# EasyEDA Pro project N01-H6.epro, board PCB1_1
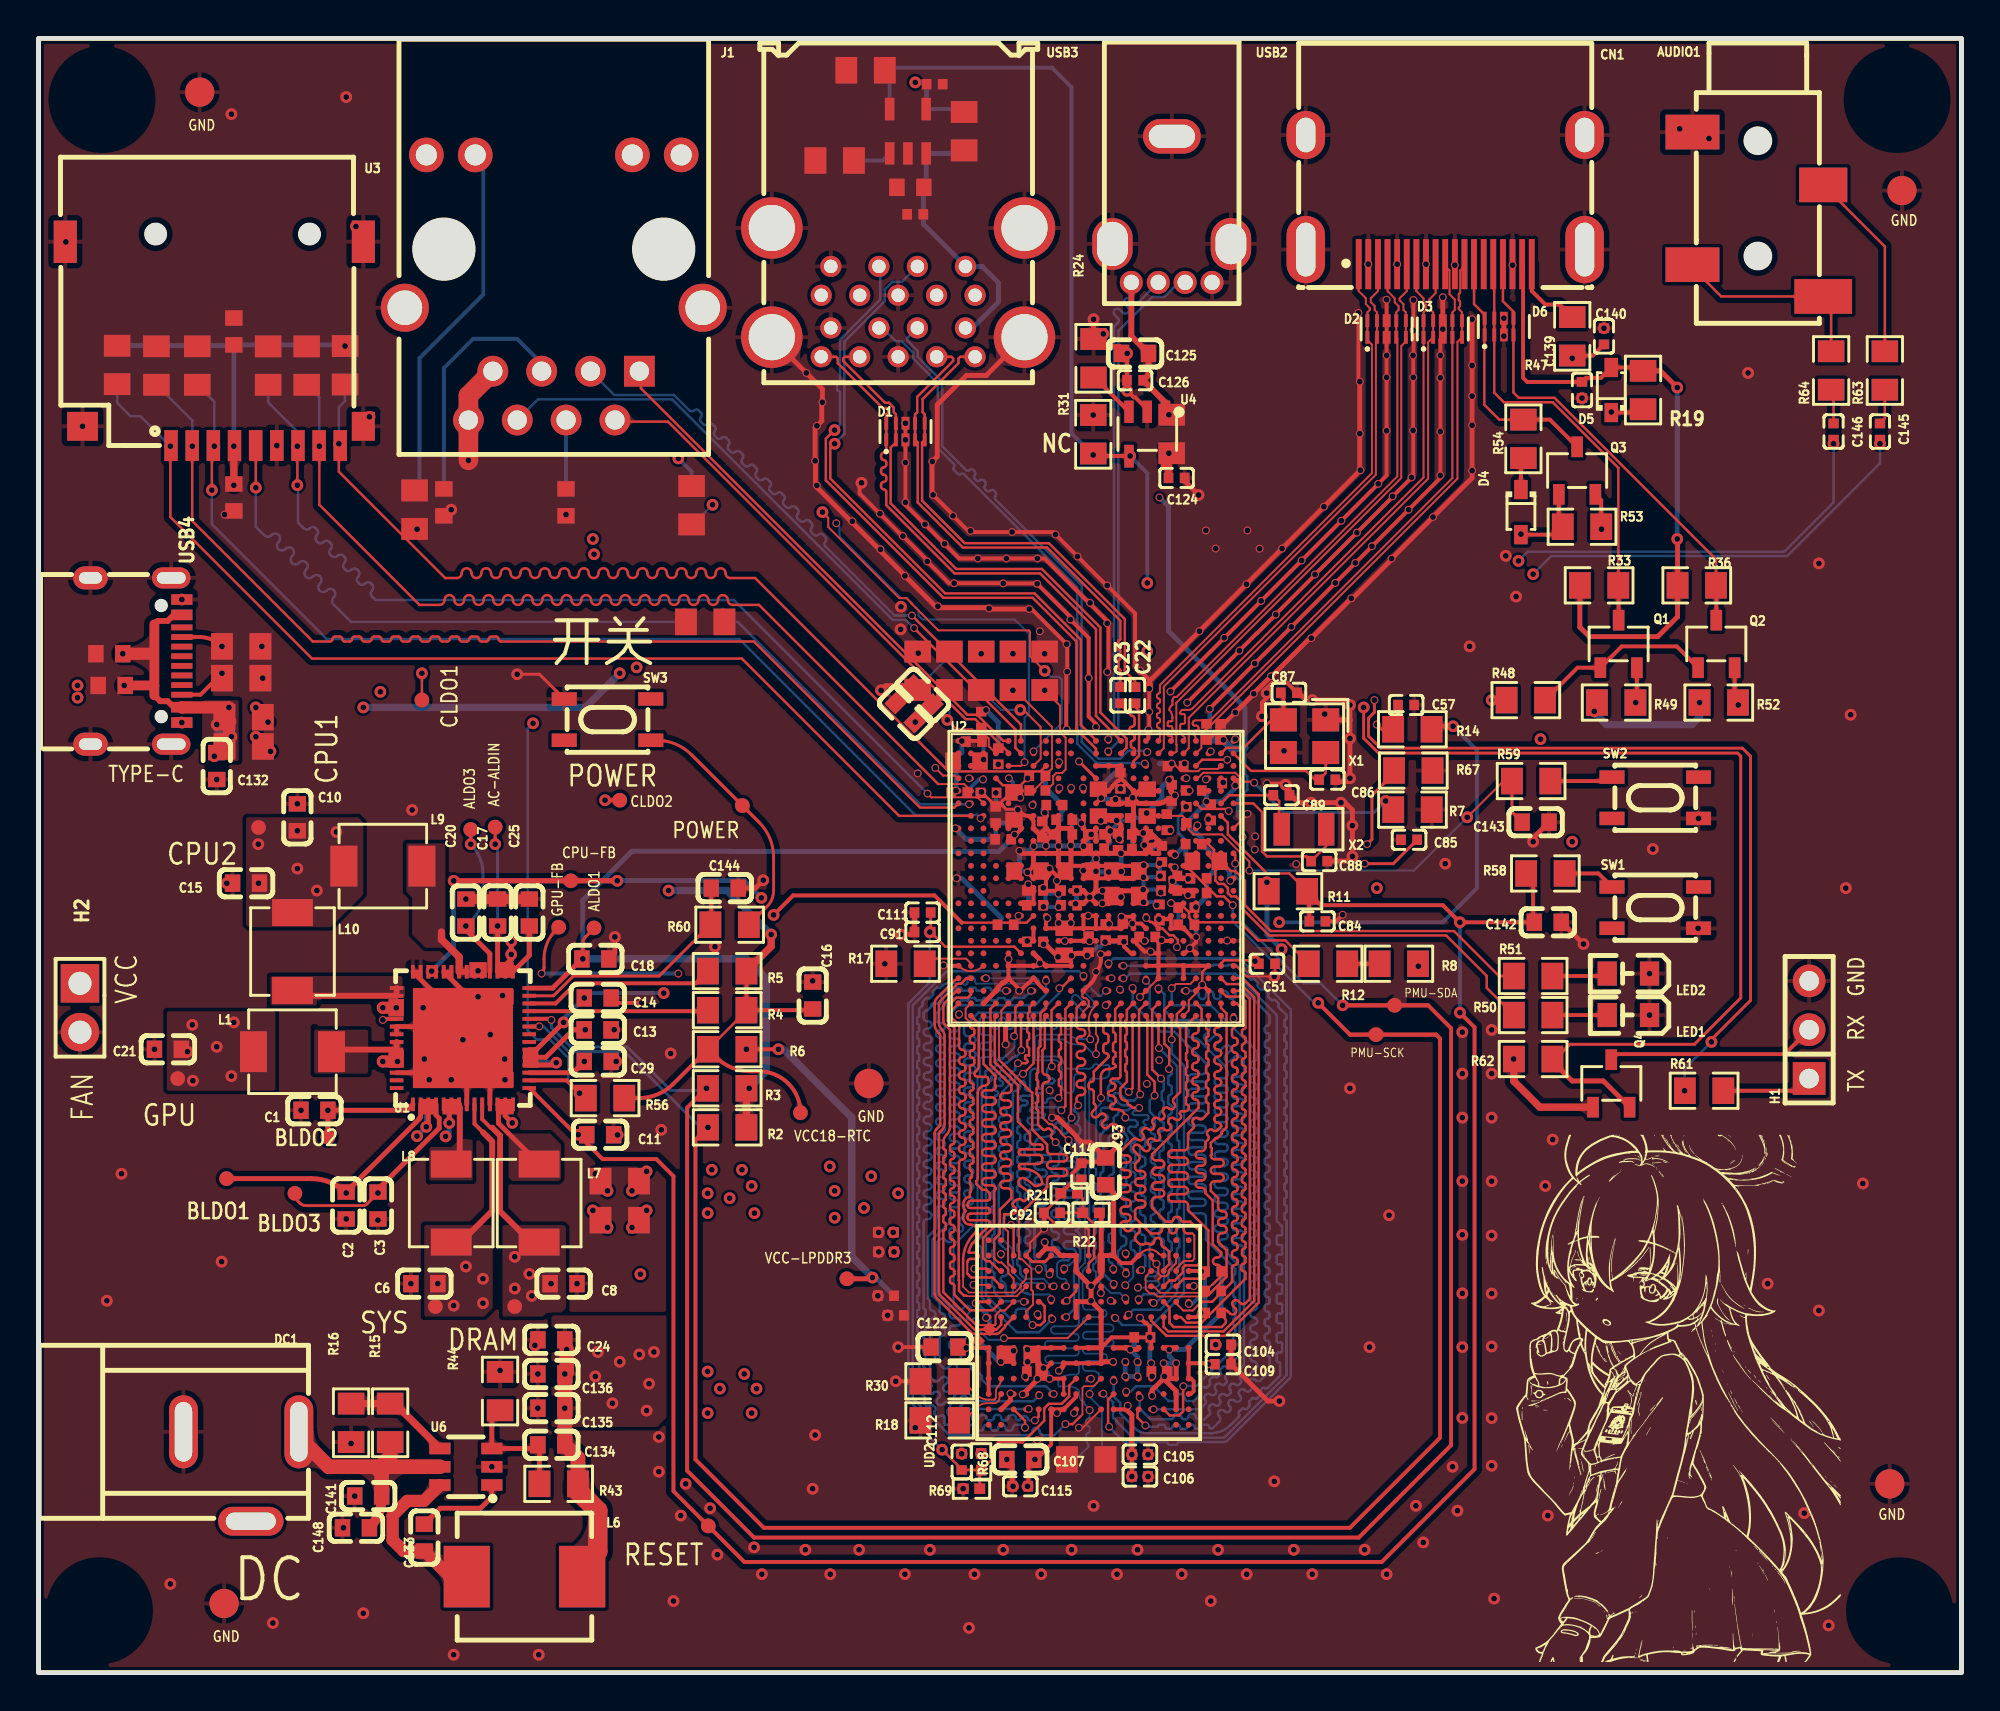
[diagram p7: board, top side]
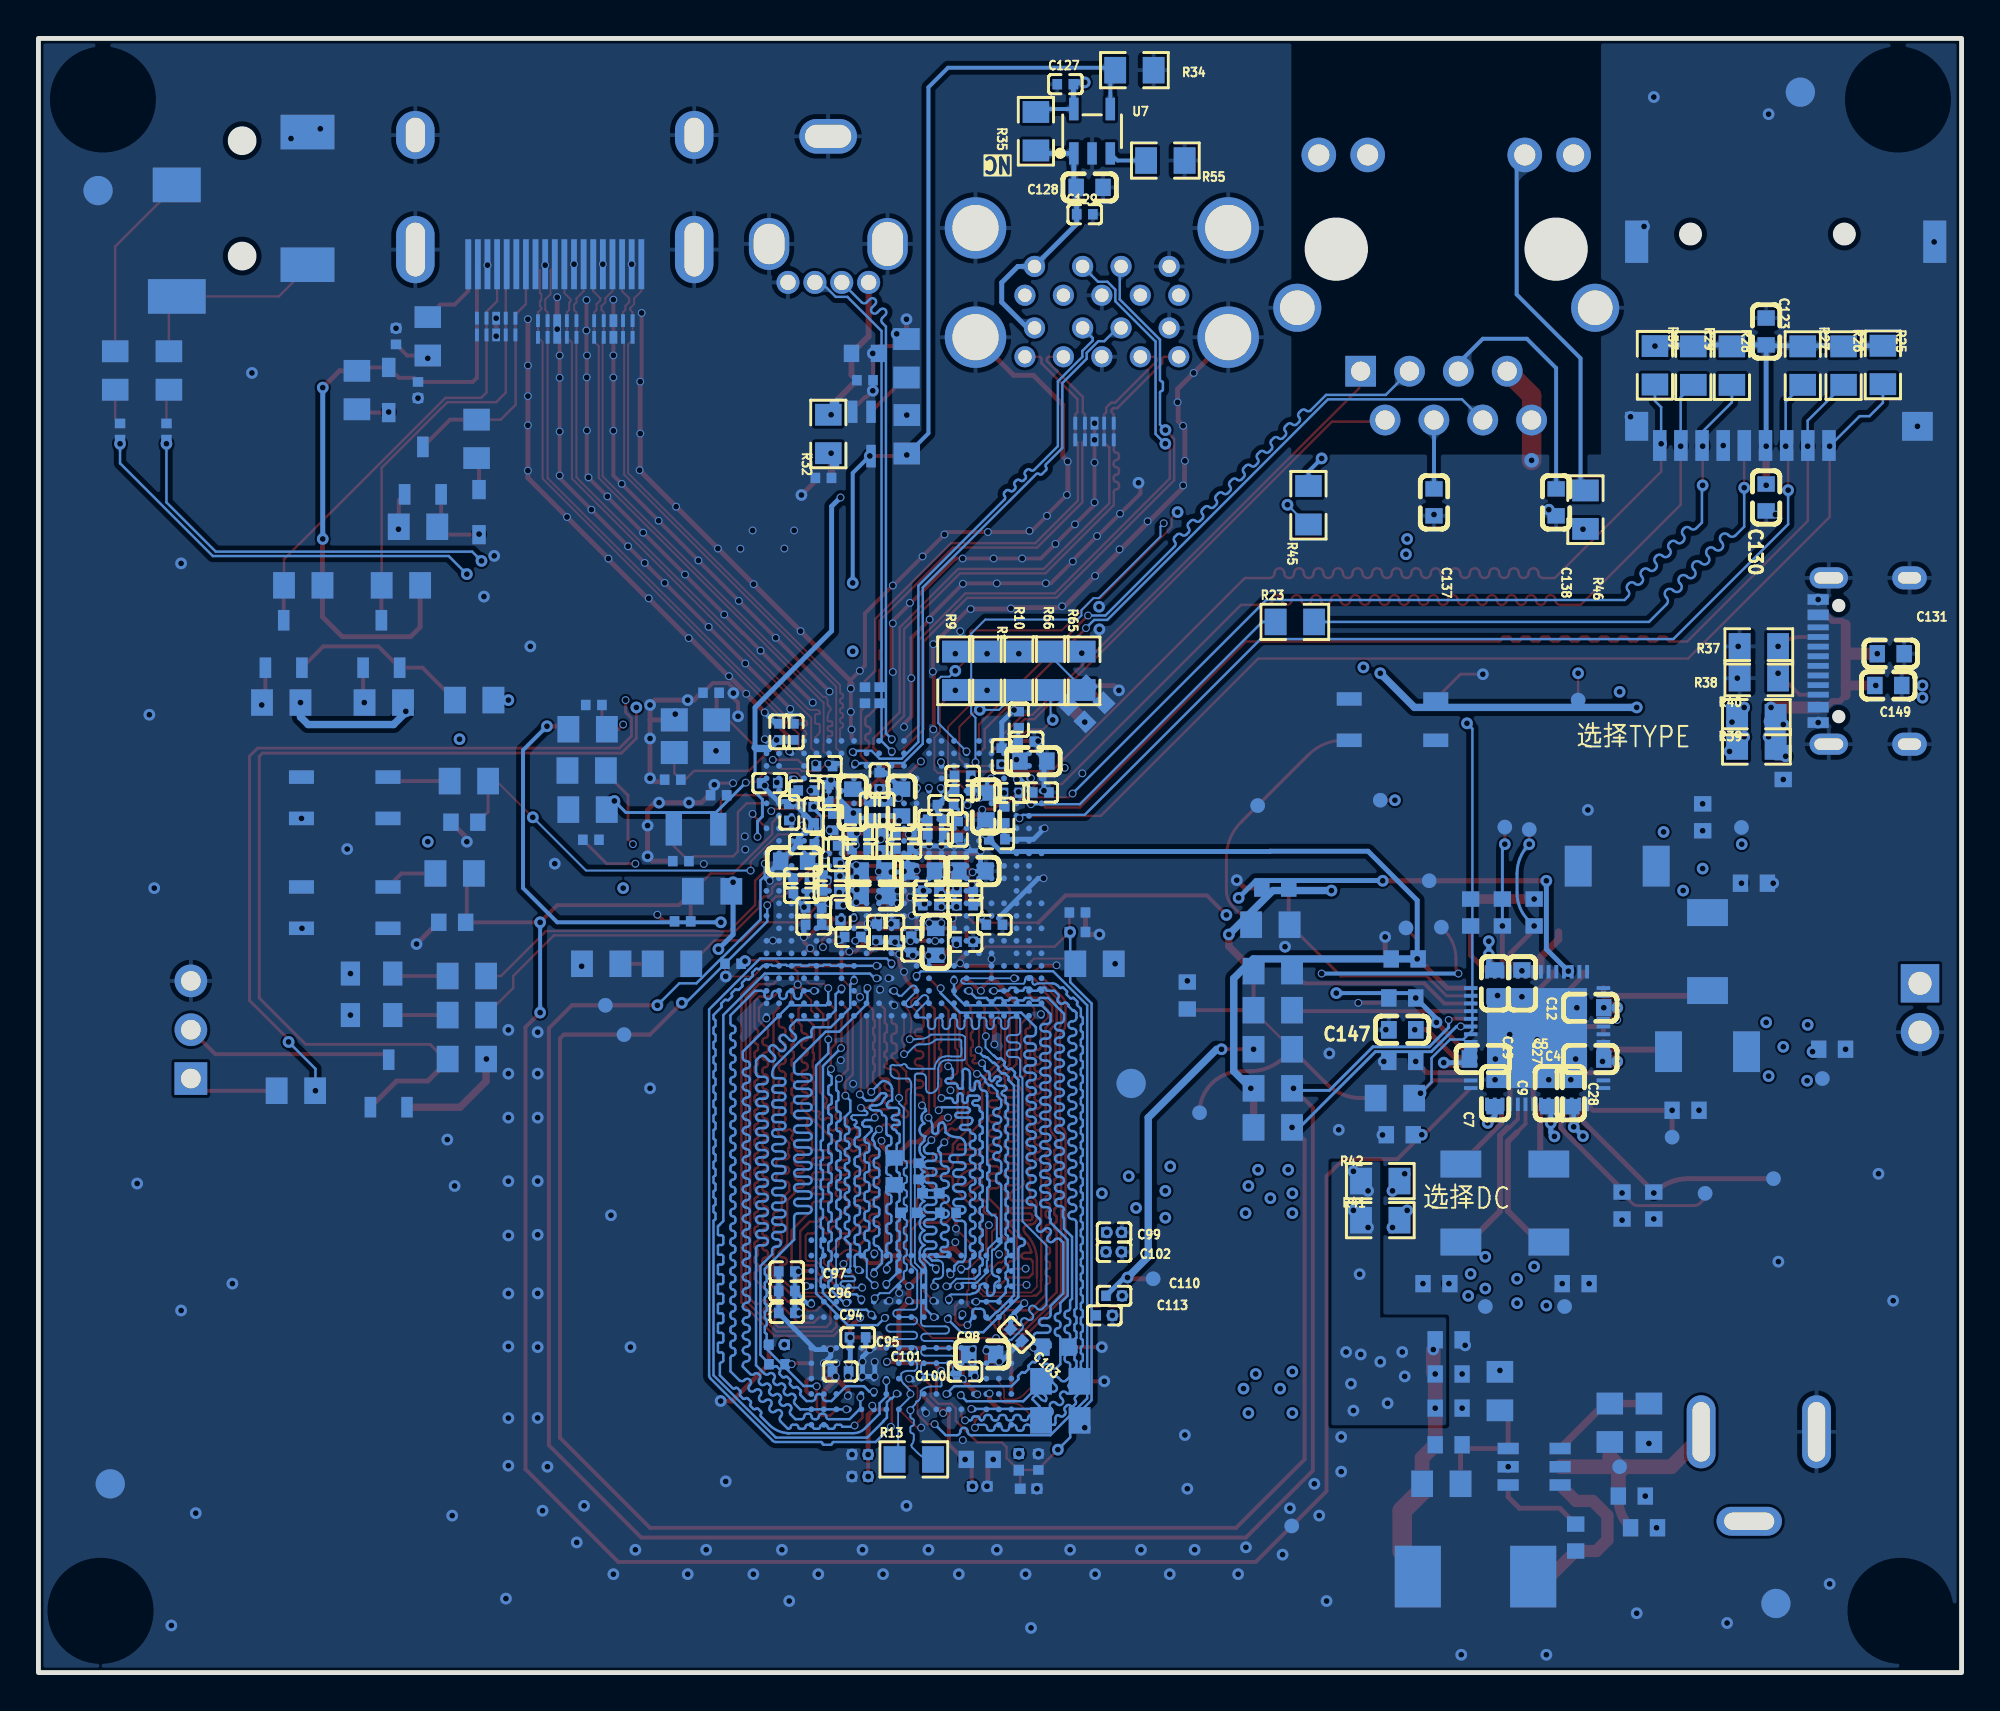
[diagram p8: board, bottom side, seen from below]

Outline 100 x 85 mm; copper layers: Top Layer, SIG, POWER, GND1, GND2, Bottom Layer. Coordinates in mm from the lower left corner of the outline.
Outline path: rectangle 0,85 100,0
Stack: Top Layer 0.035mm Outer layer thickness 1oz / Dielectric1 0.0994mm 3313 RC57% 4.2mil / Dielectric2 0.55mm 0.55mm H/H No copper / SIG 0.0152mm Inner layer thickness / Dielectric3 0.1088mm 2116 RC54% 4.9mil / POWER 0.0152mm Inner layer thickness / Dielectric4 0.55mm 0.55mm H/H No copper / Dielectric5 0.0994mm 3313 RC57% 4.2mil / Bottom Layer 0.035mm Outer layer thickness 1oz

## Design rules (mm)
net SDQS0N: SDQ0
net SDQS0P: SDQ0
net SDQS1P: SDQ1
net SDQS2N: SDQ2
net SDQS2P: SDQ2
net SDQS3N: SDQ3
net SDQS3P: SDQ3
net SCKN: SCK
net SCKP: SCK
net SDQS1N: SDQ1
net HTX0N: HTX0
net HTXCN: HTX3
net HTX1N: HTX1
net HTX2P: HTX2
net HTX2N: HTX2
net HTX1P: HTX1
net HTX0P: HTX0
net HTXCP: HTX3
net USB3-DM: USB3
net USB3-DP: USB3
net USB0-DP: USB0
net USB0-DM: USB0
net USB1-SSRXP: USB1_RX
net USB1-AP-SSTXP: USB1_AP_TX
net USB1-AP-SSTXN: USB1_AP_TX
net USB1-SSTXP: USB1_TX
net USB1-SSTXN: USB1_TX
net USB1-SSRXN: USB1_RX
net USB1-DP: USB1
net USB1-DM: USB1
net EPHY-TXP: ETH-TX
net EPHY-TXN: ETH-TX
net EPHY-RXN: ETH-RX
net EPHY-RXP: ETH-RX
spacing copperThickness1oz (default): track to track 0.102, other pairs 0.076 to 0.3
spacing copperThickness2oz: track to track 0.203, other pairs 0.152 to 0.3
track width copperThickness1oz (default): min 0.089, default 0.127, max 2.54
track width copperThickness2oz: min 0.203, default 0.254, max 2.54
differential pair differentialPair (default): width min 0.089, default 0.254, max 2.54; gap min 0.102, default 0.152
eq len grp SD uses default
net VCC-DRAM uses copperRegion1
net VDD-SYS uses copperRegion1
net VDD-CPU uses copperRegion1
net VDD-GPU uses copperRegion1
net USB-5V uses copperRegion1
net GND uses copperRegion
net DC-5V uses copperRegion1
net LXD uses copperRegion1
net LXE uses copperRegion1
net LXA uses copperRegion1
net LXB uses copperRegion1
net LXC uses copperRegion1

## Placement (name value [footprint] x y rotation side)
AUDIO1  PJ-327C-4A  [AUDIO-SMD_PJ-327C-4A]  89.41 75.86 0 top
C1  4.7uF  [C0603]  14.35 29.25 0 top
C2  4.7uF  [C0603]  16 24.29 90 top
C3  4.7uF  [C0603]  17.65 24.29 90 top
C4  10uF  [C0603]  19.3 31.91 180 bottom
C5  10uF  [C0603]  24.89 31.91 0 bottom
C6  10uF  [C0603]  20.07 20.23 0 top
C7  10uF  [C0603]  24.26 30.14 270 bottom
C8  10uF  [C0603]  27.31 20.23 180 top
C9  10uF  [C0603]  21.46 30.14 270 bottom
C10  10uF  [C0603]  13.46 44.49 270 top
C11  1nF  [C0603]  29.21 27.98 180 top
C12  10uF  [C0603]  19.3 34.58 180 bottom
C13  10uF  [C0603]  29.08 33.44 180 top
C14  10uF  [C0603]  29.08 35.09 180 top
C15  10uF  [C0603]  10.8 41.06 0 top
C16  4.7uF  [C0603]  40.26 35.22 270 top
C17  10uF  [C0603]  23.88 39.53 270 top
C18  10uF  [C0603]  28.96 37.12 180 top
C19  10uF  [C0603]  24.26 35.85 90 bottom
C20  10uF  [C0603]  22.23 39.53 270 top
C21  10uF  [C0603]  6.73 32.42 0 top
C22  100nF  [C0402]  57.02 50.84 90 top
C23  100nF  [C0402]  56.26 50.84 90 top
C24  100nF  [C0603]  26.67 17.31 0 top
C25  1uF  [C0603]  25.53 39.53 90 top
C26  1uF  [C0402]  52.2 43.85 90 bottom
C27  10uF  [C0603]  22.86 35.85 90 bottom
C28  10uF  [C0603]  20.32 30.14 270 bottom
C29  10uF  [C0603]  29.08 31.79 180 top
C30  10uF  [C0603]  45.09 49.95 315 top
C31  1uF  [C0402]  59.69 39.79 180 bottom
C32  1uF  [C0402]  55 42.86 0 bottom
C33  100nF  [C0402]  56.26 46.39 270 bottom
C34  1uF  [C0402]  49.91 47.66 270 bottom
C35  1uF  [C0402]  49.78 44.61 90 bottom
C36  100nF  [C0402]  50.29 38.9 0 bottom
C37  100nF  [C0402]  52.83 45.12 180 bottom
C38  100nF  [C0402]  57.28 42.84 180 bottom
C39  100nF  [C0402]  60.07 45.88 180 bottom
C40  100nF  [C0402]  49.4 45.76 0 bottom
C41  100nF  [C0402]  61.47 48.93 270 bottom
C42  100nF  [C0402]  47.88 45.78 0 bottom
C43  100nF  [C0402]  53.34 44.36 0 bottom
C44  100nF  [C0402]  60.33 40.55 180 bottom
C45  100nF  [C0402]  56.77 44.87 270 bottom
C46  100nF  [C0402]  56.13 43.22 90 bottom
C47  1nF  [C0402]  49.02 49.57 270 bottom
C48  4.7uF  [C0603]  60.71 42.2 180 bottom
C49  1uF  [C0402]  59.69 44.61 90 bottom
C50  100nF  [C0402]  60.07 43.09 180 bottom
C51  100nF  [C0402]  63.88 36.87 180 top
C52  100nF  [C0402]  60.33 41.31 180 bottom
C53  4.7uF  [C0603]  48.26 47.41 0 bottom
C54  10uF  [C0603]  50.73 45.05 90 bottom
C55  100nF  [C0402]  51.94 45.88 180 bottom
C56  1uF  [C0402]  51.94 46.65 180 bottom
C57  1nF  [C0402]  71.12 50.33 180 top
C58  100nF  [C0402]  58.67 44.23 270 bottom
C59  100nF  [C0402]  59.13 47.15 0 bottom
C60  22uF  [C0603]  56.52 41.69 0 bottom
C61  10uF  [C0603]  56.52 40.42 0 bottom
C62  1uF  [C0402]  58.42 42.58 270 bottom
C63  4.7uF  [C0603]  45.97 50.84 315 top
C64  100nF  [C0402]  60.74 48.93 270 bottom
C65  220nF  [C0402]  61.98 46.26 180 bottom
C66  100nF  [C0402]  48.64 48.42 0 bottom
C67  100nF  [C0402]  50.16 43.34 0 bottom
C68  1uF  [C0402]  58.8 41.44 180 bottom
C69  100nF  [C0402]  58.29 39.53 90 bottom
C70  100nF  [C0402]  58.8 40.68 180 bottom
C71  10uF  [C0603]  51.44 41.69 0 bottom
C72  10uF  [C0603]  54.1 41.69 180 bottom
C73  1uF  [C0402]  51.82 40.68 0 bottom
C74  1uF  [C0402]  51.82 39.91 0 bottom
C75  100nF  [C0402]  53.59 40.68 180 bottom
C76  100nF  [C0402]  53.59 39.91 180 bottom
C77  10uF  [C0603]  57.66 45.25 270 bottom
C78  1uF  [C0402]  54.99 43.6 0 bottom
C79  1uF  [C0402]  57.28 43.6 180 bottom
C80  100nF  [C0402]  56.01 44.87 270 bottom
C81  100nF  [C0402]  58.93 45.76 90 bottom
C82  10uF  [C0603]  55.12 45.25 270 bottom
C83  1nF  [C0402]  60.96 44.74 270 bottom
C84  1nF  [C0402]  66.5 39.08 180 top
C85  1uF  [C0402]  71.27 43.32 0 top
C86  22pF  [C0402]  67.02 46.44 0 top
C87  22pF  [C0402]  65.02 50.96 0 top
C88  22pF  [C0402]  66.6 42.21 0 top
C89  22pF  [C0402]  64.63 45.63 0 top
C90  100nF  [C0402]  53.34 43.6 0 bottom
C91  100nF  [C0402]  45.97 38.52 0 top
C92  100nF  [C0402]  52.71 23.91 0 top
C93  10uF  [C0603]  55.5 26.07 270 top
C94  1uF  [C0402]  61.09 18.71 180 bottom
C95  1uF  [C0402]  57.4 17.44 0 bottom
C96  100nF  [C0402]  61.09 19.85 180 bottom
C97  100nF  [C0402]  61.09 20.86 180 bottom
C98  10uF  [C0603]  50.93 16.55 0 bottom
C99  100nF  [C0402]  44.07 22.9 0 bottom
C100  100nF  [C0402]  51.82 15.66 180 bottom
C101  100nF  [C0402]  58.29 15.66 180 bottom
C102  100nF  [C0402]  44.07 21.88 0 bottom
C103  100nF  [C0402]  49.15 17.56 45 bottom
C104  100nF  [C0402]  61.59 17.05 180 top
C105  NC-100nF  [C0402]  57.28 11.34 180 top
C106  NC-1uF  [C0402]  57.28 10.2 180 top
C107  NC-10uF  [C0603]  51.05 11.09 0 top
C108  100nF  [C0402]  59.69 38.9 180 bottom
C109  100nF  [C0402]  61.59 16.04 180 top
C110  1uF  [C0402]  44.07 19.59 0 bottom
C111  100nF  [C0402]  45.97 39.53 0 top
C112  NC-100nF  [C0402]  48.01 10.96 270 top
C113  NC-100nF  [C0402]  44.58 18.58 0 bottom
C114  100nF  [C0402]  54.23 26.07 270 top
C115  NC-100nF  [C0402]  51.05 9.69 0 top
C116  NC-1uF  [C0402]  54.61 37.88 270 bottom
C117  10uF  [C0603]  53.34 38.01 270 bottom
C118  1uF  [C0402]  51.82 38.01 0 bottom
C119  1uF  [C0402]  55.5 38.52 270 bottom
C120  100nF  [C0402]  57.66 38.26 180 bottom
C121  100nF  [C0402]  56.39 38.52 270 bottom
C122  10uF  [C0603]  47.12 16.93 0 top
C123  10uF  [C0603]  10.16 69.76 90 bottom
C124  1uF  [C0402]  59.18 62.14 180 top
C125  10uF  [C0603]  57.02 68.62 180 top
C126  100nF  [C0402]  57.02 67.22 0 top
C127  1uF  [C0402]  46.6 82.62 180 bottom
C128  10uF  [C0603]  45.34 77.25 180 bottom
C129  100nF  [C0402]  45.59 75.86 0 bottom
C130  22uF  [C0603]  10.16 61.12 90 bottom
C131  22uF  [C0603]  3.68 53 0 bottom
C132  100nF  [C0603]  9.27 47.15 270 top
C133  100nF  [C0603]  20.07 7.02 270 top
C134  39pF  [C0603]  26.67 11.85 180 top
C135  22uF  [C0603]  26.67 13.75 0 top
C136  22uF  [C0603]  26.67 15.53 0 top
C137  100nF  [C0603]  27.43 60.87 90 bottom
C138  100nF  [C0603]  21.08 60.87 90 bottom
C139  100nF  [C0402]  80.26 66.71 270 top
C140  100nF  [C0402]  81.41 69.51 90 top
C141  22uF  [C0603]  17.15 9.18 0 top
C142  470nF  [C0603]  78.49 39.03 0 top
C143  470nF  [C0603]  77.85 44.23 0 top
C144  470nF  [C0603]  35.69 40.8 0 top
C145  4.7uF  [C0402]  95.76 64.55 270 top
C146  4.7uF  [C0402]  93.34 64.55 270 top
C147  22uF  [C0603]  29.08 33.44 180 bottom
C148  22uF  [C0603]  16.51 7.53 0 top
C149  22uF  [C0603]  3.81 51.34 180 bottom
CN1  KH-HDMI-19P-Cu  [HDMI-SMD_KH-HDMI-19P-CU]  73.15 76.62 180 top
D1  AZ1045-04F.R7G  [DFN2510-10_L2.5-W1.0-P0.50-BL]  45.09 64.55 0 top
D2  AZ1045-04F.R7G  [DFN2510-10_L2.5-W1.0-P0.50-BL]  70.1 69.89 0 top
D3  AZ1045-04F.R7G  [DFN2510-10_L2.5-W1.0-P0.50-BL]  73.03 69.89 0 top
D4  1N5819WS  [SOD-323_L1.8-W1.3-LS2.5-RD]  77.09 60.36 270 top
D5  1N5819WS  [SOD-323_L1.8-W1.3-LS2.5-RD]  81.79 66.71 90 top
D6  AZ1045-04F.R7G  [DFN2510-10_L2.5-W1.0-P0.50-BL]  76.2 70.01 0 top
DC1  DC-005-A200  [DC-IN-TH_DC-005-A200]  10.54 10.2 0 top
H1  PZ254V-11-03P  [HDR-TH_3P-P2.54-V-M_PZ254V-11-03P]  92.08 33.44 90 top
H2  PZ254V-11-02P  [HDR-TH_2P-P2.54-V-M]  2.16 34.58 270 top
J1  HR911105A  [RJ45-TH_HR911105A]  26.8 72.05 180 top
L1  1.5uH  [IND-SMD_L4.4-W4.2]  13.21 32.29 180 top
L6  6.8uH  [IND-SMD_L7.0-W6.6]  25.27 4.99 0 top
L7  1.5uH  [IND-SMD_L4.4-W4.2]  26.04 24.42 270 top
L8  1.5uH  [IND-SMD_L4.4-W4.2]  21.46 24.42 270 top
L9  1.5uH  [IND-SMD_L4.4-W4.2]  17.91 41.95 180 top
L10  1.5uH  [IND-SMD_L4.4-W4.2]  13.21 37.5 90 top
LED1  GL0805UB01  [LED0805-RD_BLUE]  82.68 34.2 180 top
LED2  GL0805UB01  [LED0805-RD_BLUE]  82.68 36.36 180 top
NOREF  -  [Pad_e9072]  15.05 27.85 0 top
NOREF#2  -  [Pad_e9184]  30.23 45.38 0 top
NOREF#3  -  [Pad_e9106]  28.89 38.73 0 top
NOREF#4  -  [Pad_e9076]  9.78 25.69 0 top
NOREF#5  -  [Pad_e9054]  70.52 34.71 0 top
NOREF#6  -  [Pad_e9362]  19.94 50.58 0 top
NOREF#7  -  [Pad_e9028]  7.24 30.9 0 top
NOREF#8  -  [Pad_e9175]  39.62 29.12 0 top
NOREF#9  -  [Pad_e9079]  13.34 24.93 0 top
NOREF#10  -  [Pad_e9069]  42.04 20.48 0 top
NOREF#11  -  [Pad_e9026]  24.77 19.04 0 top
NOREF#12  -  [Pad_e9059]  8.38 82.21 0 top
NOREF#13  -  [Pad_e9061]  9.65 3.59 0 top
NOREF#14  -  [Pad_e9036]  34.83 7.63 0 top
NOREF#15  -  [Pad_e9885]  96.27 9.82 0 top
NOREF#16  -  [Pad_e9060]  96.9 77.09 0 top
NOREF#17  -  [Pad_e9027]  20.64 19.04 0 top
NOREF#18  -  [Pad_e9355]  17.78 10.7 0 top
NOREF#19  -  [Pad_e9042]  36.6 45.1 0 top
NOREF#20  -  [Pad_e9351]  9.91 49.47 0 top
NOREF#21  -  [Pad_e9062]  43.18 30.64 0 top
NOREF#22  -  [Pad_e9101]  27.05 38.77 0 top
NOREF#23  -  [Pad_e9051]  69.55 33.18 0 top
NOREF#24  -  [Pad_e9032]  27.68 41.18 0 top
NOREF#25  -  [Pad_e9097]  23.75 43.98 0 top
NOREF#26  -  [Pad_e9029]  11.45 43.96 0 top
NOREF#27  -  [Pad_e9091]  22.48 43.85 0 top
Q1  BSN20  [SOT-23-3_L2.9-W1.6-P1.90-LS2.8-BR]  82.17 53.5 270 top
Q2  BSN20  [SOT-23-3_L2.9-W1.6-P1.90-LS2.8-BR]  87.25 53.5 270 top
Q3  BSN20  [SOT-23-3_L2.9-W1.6-P1.90-LS2.8-BR]  80.01 62.52 270 top
Q4  BSN20  [SOT-23-3_L2.9-W1.6-P1.90-LS2.8-BR]  81.79 30.64 270 top
R1  10kΩ  [R0805]  50.67 52.11 90 bottom
R2  2kΩ  [R0805]  35.81 28.36 180 top
R3  2kΩ  [R0805]  35.81 30.39 180 top
R4  0Ω  [R0805]  35.81 34.45 180 top
R5  0Ω  [R0805]  35.81 36.49 180 top
R6  0Ω  [R0805]  35.81 32.42 0 top
R7  10kΩ  [R0805]  71.45 44.89 0 top
R8  1kΩ  [R0805]  70.74 36.87 180 top
R9  2kΩ  [R0805]  52.32 52.11 90 bottom
R10  2kΩ  [R0805]  49.02 52.11 90 bottom
R11  10kΩ  [R0805]  64.97 40.64 0 top
R12  10kΩ  [R0805]  67.06 36.87 180 top
R13  100Ω  [R0805]  54.48 11.09 180 bottom
R14  1kΩ  [R0805]  71.44 49.07 0 top
R15  100kΩ  [R0805]  18.29 12.99 270 top
R16  1MΩ  [R0805]  16.26 12.99 90 top
R17  240Ω  [R0805]  45.09 36.87 0 top
R18  240Ω  [R0805]  46.86 13.12 180 top
R19  0Ω  [R0805]  83.44 66.71 90 top
R21  2kΩ  [R0402]  53.59 24.93 0 top
R22  2kΩ  [R0402]  54.74 23.91 0 top
R23  33Ω  [R0805]  34.67 54.65 180 bottom
R24  6.8kΩ  [R0805]  54.86 68.36 270 top
R25  10KΩ  [R0805]  4.09 68.02 90 bottom
R26  10KΩ  [R0805]  6.13 67.98 90 bottom
R27  10KΩ  [R0805]  8.26 67.98 90 bottom
R28  10KΩ  [R0805]  11.94 67.98 90 bottom
R29  10KΩ  [R0805]  13.95 67.98 90 bottom
R30  240Ω  [R0805]  46.86 15.15 180 top
R31  100kΩ  [R0805]  54.85 64.41 270 top
R32  NC-0Ω  [R0805]  58.93 64.43 90 bottom
R33  1.8kΩ  [R0805]  81.15 56.55 180 top
R34  100kΩ  [R0805]  43.01 83.35 0 bottom
R35  NC-0Ω  [R0805]  48.13 80.17 270 bottom
R36  1.8kΩ  [R0805]  86.23 56.55 180 top
R37  5.1kΩ  [R0805]  10.54 53.38 180 bottom
R38  5.1kΩ  [R0805]  10.54 51.73 180 bottom
R39  0Ω  [R0805]  10.67 48.17 0 bottom
R40  0Ω  [R0805]  10.67 49.69 0 bottom
R41  0Ω  [R0805]  30.23 23.53 0 bottom
R42  0Ω  [R0805]  30.23 25.56 0 bottom
R43  110kΩ  [R0805]  27.05 9.82 0 top
R44  15kΩ  [R0805]  24 14.64 270 top
R45  1kΩ  [R0805]  33.96 60.72 90 bottom
R46  1kΩ  [R0805]  19.56 60.49 90 bottom
R47  1kΩ  [R0805]  79.76 69.51 90 top
R48  0Ω  [R0805]  77.34 50.58 0 top
R49  10KΩ  [R0805]  82.04 50.46 0 top
R50  330Ω  [R0805]  77.72 34.2 0 top
R51  330Ω  [R0805]  77.72 36.23 0 top
R52  10KΩ  [R0805]  87.38 50.46 0 top
R53  56kΩ  [R0805]  80.26 59.6 180 top
R54  56kΩ  [R0805]  77.22 64.17 270 top
R55  6.8kΩ  [R0805]  41.4 78.65 0 bottom
R56  10kΩ  [R0805]  29.46 29.88 180 top
R57  10KΩ  [R0805]  15.94 68 90 bottom
R58  1kΩ  [R0805]  78.36 41.57 0 top
R59  1kΩ  [R0805]  77.62 46.37 0 top
R60  1kΩ  [R0805]  35.94 38.9 0 top
R61  0Ω  [R0805]  86.61 30.26 0 top
R62  10KΩ  [R0805]  77.72 31.91 0 top
R63  0Ω  [R0805]  96.01 67.73 90 top
R64  0Ω  [R0805]  93.22 67.73 90 top
R65  3kΩ  [R0805]  45.72 52.11 270 bottom
R66  3kΩ  [R0805]  47.37 52.11 270 bottom
R67  150kΩ  [R0805]  71.49 46.92 0 top
R68  2kΩ  [R0402]  49.02 10.96 90 top
R69  2kΩ  [R0402]  48.51 9.56 0 top
SW1  TS-KG89S-AT25F  [SW-SMD_4P-L4.2-W3.3-P2.15-LS5.1]  84.07 39.79 0 top
SW2  TS-KG89S-AT25F  [SW-SMD_4P-L4.2-W3.3-P2.15-LS5.1]  84.07 45.5 0 top
SW3  TS-KG89S-AT25F  [SW-SMD_4P-L4.2-W3.3-P2.15-LS5.1]  29.59 49.57 180 top
U1  AXP805  [QFN-56_L7.0-W7.0-P0.40-TL-EP5.2]  22.07 33 90 top
U2  1  [H6_BGA451]  54.99 41.31 270 top
U3  HX TF PUSH  [TF-SMD_TF-PUSH]  9.14 69.12 180 top
U4  SY6280AAC  [SOT-23-5_L3.0-W1.7-P0.95-LS2.8-BL]  57.66 64.43 180 top
U6  RT7295AGJ6F  [SOT-23-6_L2.9-W1.6-P0.95-LS2.8-BR]  22.23 10.7 0 top
U7  SY6280AAC  [SOT-23-5_L3.0-W1.7-P0.95-LS2.8-BL]  45.21 80.17 180 bottom
UD2  1  [LPDDR3_FBGA178]  54.61 17.69 90 top
USB2  906-162A1011D10200  [USB-A-TH_4P-P1.40-V-F-C39416]  58.93 76.11 180 top
USB3  USB-303WSD-BRY  [USB-A-TH_XUNPU_USB-303WSD-BRY]  44.7 71.79 180 top
USB4  TYPE-C 16PIN 2MD(073)  [USB-C-SMD_TYPE-C-16PIN-2MD-073]  5.08 52.61 270 top
X1  24MHz  [CRYSTAL-SMD_4P-L3.2-W2.5-BL]  65.84 48.71 180 top
X2  32.768kHz  [OSC-SMD_L3.2-W1.5]  65.81 43.87 0 top

## Footprints (pads in the part's own frame, mm; a bottom-side part is the same pattern mirrored in y, then rotated)
AUDIO-SMD_PJ-327C-4A
  rect 2.8x1.8 hole 0.001: 1(-3.4,4.275) 2(-3.4,-2.625)
  rect 2.5x1.8 hole 0.001: 3(3.4,1.525)
  rect 3x1.8 hole 0.001: 4(3.4,-4.275)
C0402
  rect 0.5x0.54 hole 0.001: 1(-0.42,0) 2(0.42,0)
C0603
  rect 0.8x0.9 hole 0.001: 1(-0.7,0) 2(0.7,0)
CRYSTAL-SMD_4P-L3.2-W2.5-BL
  rect 1.4x1.2 hole 0.001: 1(-1.1,-0.85) 2(1.1,-0.85) 3(1.1,0.85) 4(-1.1,0.85)
DC-IN-TH_DC-005-A200
  oval 1.5x3.8 hole 0.9x3.1: 1(3,2.325) 2(-3,2.325)
  oval 3.4x1.5 hole 2.6x0.9: 3(0.5,-2.325)
DFN2510-10_L2.5-W1.0-P0.50-BL
  rect 0.2x0.665 hole 0.001: 1(-1,-0.433) 2(-0.5,-0.433) 4(0.5,-0.433) 5(1,-0.433) 6(1,0.433) 7(0.5,0.433) 9(-0.5,0.433) 10(-1,0.433)
  rect 0.4x0.665 hole 0.001: 3(0,-0.433) 8(0,0.433)
H6_BGA451
  round 0.3 hole 0.001: A1(-7.15,-7.15) A3(-7.15,-5.85) A5(-7.15,-4.55) A6(-7.15,-3.9) A8(-7.15,-2.6) A9(-7.15,-1.95) A10(-7.15,-1.3) A12(-7.15,0) A13(-7.15,0.65) A14(-7.15,1.3) A16(-7.15,2.6) A17(-7.15,3.25) A18(-7.15,3.9) A19(-7.15,4.55) A20(-7.15,5.2) A21(-7.15,5.85) A22(-7.15,6.5) A23(-7.15,7.15) AA1(5.85,-7.15) AA2(5.85,-6.5) AA3(5.85,-5.85) AA4(5.85,-5.2) AA5(5.85,-4.55) AA7(5.85,-3.25) AA8(5.85,-2.6) AA10(5.85,-1.3) AA11(5.85,-0.65) AA13(5.85,0.65) AA14(5.85,1.3) AA15(5.85,1.95) AA16(5.85,2.6) AA17(5.85,3.25) AA19(5.85,4.55) AA20(5.85,5.2) AA21(5.85,5.85) AA22(5.85,6.5) AA23(5.85,7.15) AB1(6.5,-7.15) AB2(6.5,-6.5) AB3(6.5,-5.85) AB4(6.5,-5.2) AB5(6.5,-4.55) AB6(6.5,-3.9) AB7(6.5,-3.25) AB8(6.5,-2.6) AB9(6.5,-1.95) AB10(6.5,-1.3) AB11(6.5,-0.65) AB12(6.5,0) AB13(6.5,0.65) AB14(6.5,1.3) AB15(6.5,1.95) AB16(6.5,2.6) AB17(6.5,3.25) AB18(6.5,3.9) AB19(6.5,4.55) AB20(6.5,5.2) AB21(6.5,5.85) AB22(6.5,6.5) AB23(6.5,7.15) AC1(7.15,-7.15) AC2(7.15,-6.5) AC3(7.15,-5.85) AC4(7.15,-5.2) AC5(7.15,-4.55) AC6(7.15,-3.9) AC7(7.15,-3.25) AC8(7.15,-2.6) AC9(7.15,-1.95) AC10(7.15,-1.3) AC11(7.15,-0.65) AC12(7.15,0) AC13(7.15,0.65) AC14(7.15,1.3) AC15(7.15,1.95) AC16(7.15,2.6) AC17(7.15,3.25) AC18(7.15,3.9) AC19(7.15,4.55) AC20(7.15,5.2) AC21(7.15,5.85) AC22(7.15,6.5) AC23(7.15,7.15) B1(-6.5,-7.15) B2(-6.5,-6.5) B3(-6.5,-5.85) B4(-6.5,-5.2) B5(-6.5,-4.55) B6(-6.5,-3.9) B7(-6.5,-3.25) B8(-6.5,-2.6) B9(-6.5,-1.95) B10(-6.5,-1.3) B12(-6.5,0) B13(-6.5,0.65) B14(-6.5,1.3) B15(-6.5,1.95) B16(-6.5,2.6) B17(-6.5,3.25) B18(-6.5,3.9) B19(-6.5,4.55) B20(-6.5,5.2) B21(-6.5,5.85) B22(-6.5,6.5) B23(-6.5,7.15) C1(-5.85,-7.15) C2(-5.85,-6.5) C3(-5.85,-5.85) C4(-5.85,-5.2) C5(-5.85,-4.55) C7(-5.85,-3.25) C8(-5.85,-2.6) C9(-5.85,-1.95) C12(-5.85,0) C13(-5.85,0.65) C14(-5.85,1.3) C15(-5.85,1.95) C16(-5.85,2.6) C18(-5.85,3.9) C19(-5.85,4.55) C20(-5.85,5.2) C22(-5.85,6.5) C23(-5.85,7.15) D1(-5.2,-7.15) D2(-5.2,-6.5) D3(-5.2,-5.85) D4(-5.2,-5.2) D5(-5.2,-4.55) D9(-5.2,-1.95) D11(-5.2,-0.65) D12(-5.2,0) D15(-5.2,1.95) D16(-5.2,2.6) D18(-5.2,3.9) D19(-5.2,4.55) D20(-5.2,5.2) D21(-5.2,5.85) D22(-5.2,6.5) D23(-5.2,7.15) E1(-4.55,-7.15) E2(-4.55,-6.5) E3(-4.55,-5.85) E4(-4.55,-5.2) E5(-4.55,-4.55) E6(-4.55,-3.9) E7(-4.55,-3.25) E8(-4.55,-2.6) E9(-4.55,-1.95) E10(-4.55,-1.3) E11(-4.55,-0.65) E12(-4.55,0) E13(-4.55,0.65) E14(-4.55,1.3) E15(-4.55,1.95) E16(-4.55,2.6) E17(-4.55,3.25) E18(-4.55,3.9) E19(-4.55,4.55) E21(-4.55,5.85) E22(-4.55,6.5) F1(-3.9,-7.15) F2(-3.9,-6.5) F3(-3.9,-5.85) F5(-3.9,-4.55) F7(-3.9,-3.25) F8(-3.9,-2.6) F9(-3.9,-1.95) F11(-3.9,-0.65) F12(-3.9,0) F13(-3.9,0.65) F14(-3.9,1.3) F15(-3.9,1.95) F16(-3.9,2.6) F17(-3.9,3.25) F19(-3.9,4.55) F20(-3.9,5.2) F21(-3.9,5.85) F22(-3.9,6.5) F23(-3.9,7.15) G2(-3.25,-6.5) G3(-3.25,-5.85) G7(-3.25,-3.25) G8(-3.25,-2.6) G9(-3.25,-1.95) G10(-3.25,-1.3) G11(-3.25,-0.65) G12(-3.25,0) G13(-3.25,0.65) G14(-3.25,1.3) G15(-3.25,1.95) G16(-3.25,2.6) G17(-3.25,3.25) G20(-3.25,5.2) G21(-3.25,5.85) G22(-3.25,6.5) H1(-2.6,-7.15) H2(-2.6,-6.5) H3(-2.6,-5.85) H4(-2.6,-5.2) H5(-2.6,-4.55) H6(-2.6,-3.9) H7(-2.6,-3.25) H8(-2.6,-2.6) H9(-2.6,-1.95) H10(-2.6,-1.3) H11(-2.6,-0.65) H12(-2.6,0) H13(-2.6,0.65) H14(-2.6,1.3) H15(-2.6,1.95) H16(-2.6,2.6) H17(-2.6,3.25) H18(-2.6,3.9) H19(-2.6,4.55) H20(-2.6,5.2) H21(-2.6,5.85) H22(-2.6,6.5) H23(-2.6,7.15) J2(-1.95,-6.5) J3(-1.95,-5.85) J5(-1.95,-4.55) J6(-1.95,-3.9) J7(-1.95,-3.25) J8(-1.95,-2.6) J9(-1.95,-1.95) J10(-1.95,-1.3) J11(-1.95,-0.65) J12(-1.95,0) J13(-1.95,0.65) J14(-1.95,1.3) J15(-1.95,1.95) J16(-1.95,2.6) J17(-1.95,3.25) J19(-1.95,4.55) J20(-1.95,5.2) J21(-1.95,5.85) J22(-1.95,6.5) K1(-1.3,-7.15) K2(-1.3,-6.5) K3(-1.3,-5.85) K7(-1.3,-3.25) K8(-1.3,-2.6) K9(-1.3,-1.95) K10(-1.3,-1.3) K11(-1.3,-0.65) K12(-1.3,0) K13(-1.3,0.65) K14(-1.3,1.3) K15(-1.3,1.95) K16(-1.3,2.6) K17(-1.3,3.25) K18(-1.3,3.9) K20(-1.3,5.2) K21(-1.3,5.85) K22(-1.3,6.5) K23(-1.3,7.15) L2(-0.65,-6.5) L3(-0.65,-5.85) L4(-0.65,-5.2) L5(-0.65,-4.55) L6(-0.65,-3.9) L7(-0.65,-3.25) L8(-0.65,-2.6) L9(-0.65,-1.95) L10(-0.65,-1.3) L11(-0.65,-0.65) L12(-0.65,0) L13(-0.65,0.65) L14(-0.65,1.3) L15(-0.65,1.95) L16(-0.65,2.6) L17(-0.65,3.25) L18(-0.65,3.9) L19(-0.65,4.55) L20(-0.65,5.2) L21(-0.65,5.85) L22(-0.65,6.5) M1(0,-7.15) M2(0,-6.5) M3(0,-5.85) M4(0,-5.2) M5(0,-4.55) M6(0,-3.9) M7(0,-3.25) M8(0,-2.6) M9(0,-1.95) M10(0,-1.3) M11(0,-0.65) M12(0,0) M13(0,0.65) M14(0,1.3) M15(0,1.95) M16(0,2.6) M17(0,3.25) M18(0,3.9) M19(0,4.55) M21(0,5.85) M22(0,6.5) M23(0,7.15) N2(0.65,-6.5) N3(0.65,-5.85) N7(0.65,-3.25) N8(0.65,-2.6) N9(0.65,-1.95) N10(0.65,-1.3) N11(0.65,-0.65) N12(0.65,0) N13(0.65,0.65) N14(0.65,1.3) N15(0.65,1.95) N16(0.65,2.6) N17(0.65,3.25) N18(0.65,3.9) N19(0.65,4.55) N20(0.65,5.2) N22(0.65,6.5) N23(0.65,7.15) P1(1.3,-7.15) P2(1.3,-6.5) P3(1.3,-5.85) P4(1.3,-5.2) P5(1.3,-4.55) P6(1.3,-3.9) P7(1.3,-3.25) P8(1.3,-2.6) P9(1.3,-1.95) P10(1.3,-1.3) P11(1.3,-0.65) P12(1.3,0) P13(1.3,0.65) P14(1.3,1.3) P15(1.3,1.95) P16(1.3,2.6) P17(1.3,3.25) P18(1.3,3.9) P19(1.3,4.55) P20(1.3,5.2) P21(1.3,5.85) P22(1.3,6.5) R2(1.95,-6.5) R3(1.95,-5.85) R5(1.95,-4.55) R6(1.95,-3.9) R7(1.95,-3.25) R8(1.95,-2.6) R9(1.95,-1.95) R10(1.95,-1.3) R11(1.95,-0.65) R12(1.95,0) R13(1.95,0.65) R14(1.95,1.3) R15(1.95,1.95) R16(1.95,2.6) R17(1.95,3.25) R18(1.95,3.9) R19(1.95,4.55) R20(1.95,5.2) R21(1.95,5.85) R22(1.95,6.5) R23(1.95,7.15) T1(2.6,-7.15) T2(2.6,-6.5) T3(2.6,-5.85) T7(2.6,-3.25) T8(2.6,-2.6) T9(2.6,-1.95) T10(2.6,-1.3) T11(2.6,-0.65) T12(2.6,0) T13(2.6,0.65) T14(2.6,1.3) T15(2.6,1.95) T16(2.6,2.6) T17(2.6,3.25) T18(2.6,3.9) T19(2.6,4.55) T20(2.6,5.2) T21(2.6,5.85) T22(2.6,6.5) U2(3.25,-6.5) U3(3.25,-5.85) U4(3.25,-5.2) U5(3.25,-4.55) U6(3.25,-3.9) U7(3.25,-3.25) U8(3.25,-2.6) U9(3.25,-1.95) U10(3.25,-1.3) U11(3.25,-0.65) U12(3.25,0) U13(3.25,0.65) U14(3.25,1.3) U15(3.25,1.95) U16(3.25,2.6) U17(3.25,3.25) U18(3.25,3.9) U19(3.25,4.55) U21(3.25,5.85) U22(3.25,6.5) U23(3.25,7.15) V1(3.9,-7.15) V2(3.9,-6.5) V3(3.9,-5.85) V5(3.9,-4.55) V6(3.9,-3.9) V7(3.9,-3.25) V9(3.9,-1.95) V10(3.9,-1.3) V11(3.9,-0.65) V13(3.9,0.65) V15(3.9,1.95) V17(3.9,3.25) V19(3.9,4.55) V20(3.9,5.2) V21(3.9,5.85) V22(3.9,6.5) V23(3.9,7.15) W1(4.55,-7.15) W2(4.55,-6.5) W3(4.55,-5.85) W4(4.55,-5.2) W5(4.55,-4.55) W7(4.55,-3.25) W8(4.55,-2.6) W10(4.55,-1.3) W11(4.55,-0.65) W13(4.55,0.65) W14(4.55,1.3) W16(4.55,2.6) W17(4.55,3.25) W19(4.55,4.55) W21(4.55,5.85) W22(4.55,6.5) W23(4.55,7.15) Y1(5.2,-7.15) Y2(5.2,-6.5) Y3(5.2,-5.85) Y5(5.2,-4.55) Y7(5.2,-3.25) Y8(5.2,-2.6) Y10(5.2,-1.3) Y11(5.2,-0.65) Y13(5.2,0.65) Y14(5.2,1.3) Y16(5.2,2.6) Y17(5.2,3.25) Y19(5.2,4.55) Y20(5.2,5.2) Y21(5.2,5.85) Y22(5.2,6.5) Y23(5.2,7.15)
HDMI-SMD_KH-HDMI-19P-CU
  rect 0.3x2.6 hole 0.001: 1(4.5,3.36) 2(4,3.36) 3(3.5,3.36) 4(3.001,3.36) 5(2.5,3.36) 6(2.001,3.36) 7(1.5,3.36) 8(1,3.36) 9(0.5,3.36) 10(0.001,3.36) 11(-0.499,3.36) 12(-1,3.36) 13(-1.5,3.36) 14(-2,3.36) 15(-2.499,3.36) 16(-2.999,3.36) 17(-3.499,3.36) 18(-3.999,3.36) 19(-4.5,3.36)
  oval 2x3.5 hole 1x2.8: 20(-7.25,2.6) 21(7.25,2.6)
  oval 2x2.5 hole 1x1.8: 22(-7.25,-3.36) 23(7.25,-3.36)
HDR-TH_2P-P2.54-V-M
  rect 2x2 hole 1.2: 1(-1.27,0)
  round 2 hole 1.2: 2(1.27,0)
HDR-TH_3P-P2.54-V-M_PZ254V-11-03P
  rect 1.7x1.7 hole 1.02: 1(-2.54,0)
  round 1.7 hole 1.02: 2(0,0) 3(2.54,0)
IND-SMD_L4.4-W4.2
  rect 1.4x2.12 hole 0.001: 1(2.028,0) 2(-2.028,0)
IND-SMD_L7.0-W6.6
  rect 2.4x3.2 hole 0.001: 1(-3,0) 2(3,0)
LED0805-RD_BLUE
  rect 1x1.25 hole 0.001: 1(-1.1,0) 2(1.1,0)
LPDDR3_FBGA178
  round 0.3 hole 0.001: A1(-4.8,5.2) A2(-4,5.2) A3(-3.2,5.2) A4(-2.4,5.2) A5(-1.6,5.2) A6(-0.8,5.2) A8(0.8,5.2) A9(1.6,5.2) A10(2.4,5.2) A11(3.2,5.2) A12(4,5.2) A13(4.8,5.2) B1(-4.8,4.55) B2(-4,4.55) B3(-3.2,4.55) B4(-2.4,4.55) B5(-1.6,4.55) B6(-0.8,4.55) B8(0.8,4.55) B9(1.6,4.55) B10(2.4,4.55) B11(3.2,4.55) B12(4,4.55) B13(4.8,4.55) C2(-4,3.9) C3(-3.2,3.9) C4(-2.4,3.9) C5(-1.6,3.9) C6(-0.8,3.9) C8(0.8,3.9) C9(1.6,3.9) C10(2.4,3.9) C11(3.2,3.9) C12(4,3.9) D2(-4,3.25) D3(-3.2,3.25) D4(-2.4,3.25) D5(-1.6,3.25) D6(-0.8,3.25) D8(0.8,3.25) D9(1.6,3.25) D10(2.4,3.25) D11(3.2,3.25) D12(4,3.25) E2(-4,2.6) E3(-3.2,2.6) E4(-2.4,2.6) E5(-1.6,2.6) E6(-0.8,2.6) E8(0.8,2.6) E9(1.6,2.6) E10(2.4,2.6) E11(3.2,2.6) E12(4,2.6) F2(-4,1.95) F3(-3.2,1.95) F4(-2.4,1.95) F5(-1.6,1.95) F6(-0.8,1.95) F8(0.8,1.95) F9(1.6,1.95) F10(2.4,1.95) F11(3.2,1.95) F12(4,1.95) G2(-4,1.3) G3(-3.2,1.3) G4(-2.4,1.3) G5(-1.6,1.3) G6(-0.8,1.3) G8(0.8,1.3) G9(1.6,1.3) G10(2.4,1.3) G11(3.2,1.3) G12(4,1.3) H2(-4,0.65) H3(-3.2,0.65) H4(-2.4,0.65) H5(-1.6,0.65) H6(-0.8,0.65) H8(0.8,0.65) H9(1.6,0.65) H10(2.4,0.65) H11(3.2,0.65) H12(4,0.65) J2(-4,0) J3(-3.2,0) J4(-2.4,0) J5(-1.6,0) J6(-0.8,0) J8(0.8,0) J9(1.6,0) J10(2.4,0) J11(3.2,0) J12(4,0) K2(-4,-0.65) K3(-3.2,-0.65) K4(-2.4,-0.65) K5(-1.6,-0.65) K6(-0.8,-0.65) K8(0.8,-0.65) K9(1.6,-0.65) K10(2.4,-0.65) K11(3.2,-0.65) K12(4,-0.65) L2(-4,-1.3) L3(-3.2,-1.3) L4(-2.4,-1.3) L5(-1.6,-1.3) L6(-0.8,-1.3) L8(0.8,-1.3) L9(1.6,-1.3) L10(2.4,-1.3) L11(3.2,-1.3) L12(4,-1.3) M2(-4,-1.95) M3(-3.2,-1.95) M4(-2.4,-1.95) M5(-1.6,-1.95) M6(-0.8,-1.95) M8(0.8,-1.95) M9(1.6,-1.95) M10(2.4,-1.95) M11(3.2,-1.95) M12(4,-1.95) N2(-4,-2.6) N3(-3.2,-2.6) N4(-2.4,-2.6) N5(-1.6,-2.6) N6(-0.8,-2.6) N8(0.8,-2.6) N9(1.6,-2.6) N10(2.4,-2.6) N11(3.2,-2.6) N12(4,-2.6) P2(-4,-3.25) P3(-3.2,-3.25) P4(-2.4,-3.25) P5(-1.6,-3.25) P6(-0.8,-3.25) P8(0.8,-3.25) P9(1.6,-3.25) P10(2.4,-3.25) P11(3.2,-3.25) P12(4,-3.25) R2(-4,-3.9) R3(-3.2,-3.9) R4(-2.4,-3.9) R5(-1.6,-3.9) R6(-0.8,-3.9) R8(0.8,-3.9) R9(1.6,-3.9) R10(2.4,-3.9) R11(3.2,-3.9) R12(4,-3.9) T1(-4.8,-4.55) T2(-4,-4.55) T3(-3.2,-4.55) T4(-2.4,-4.55) T5(-1.6,-4.55) T6(-0.8,-4.55) T8(0.8,-4.55) T9(1.6,-4.55) T10(2.4,-4.55) T11(3.2,-4.55) T12(4,-4.55) T13(4.8,-4.55) U1(-4.8,-5.2) U2(-4,-5.2) U3(-3.2,-5.2) U4(-2.4,-5.2) U5(-1.6,-5.2) U6(-0.8,-5.2) U8(0.8,-5.2) U9(1.6,-5.2) U10(2.4,-5.2) U11(3.2,-5.2) U12(4,-5.2) U13(4.8,-5.2)
OSC-SMD_L3.2-W1.5
  rect 0.85x1.7 hole 0.001: 1(-1.155,0) 2(1.155,0)
Pad_e9026
  round 0.762 hole 0.001: 1(0,0)
Pad_e9027
  round 0.762 hole 0.001: 2(0,0)
Pad_e9028
  round 0.762 hole 0.001: 3(0,0)
Pad_e9029
  round 0.762 hole 0.001: 4(0,0)
Pad_e9032
  round 0.762 hole 0.001: 1(0,0)
Pad_e9036
  round 0.762 hole 0.001: 5(0,0)
Pad_e9042
  round 0.762 hole 0.001: 1(0,0)
Pad_e9051
  round 0.762 hole 0.001: 1(0,0)
Pad_e9054
  round 0.762 hole 0.001: 2(0,0)
Pad_e9059
  round 1.524 hole 0.001: 1(0,0)
Pad_e9060
  round 1.524 hole 0.001: 1(0,0)
Pad_e9061
  round 1.524 hole 0.001: 3(0,0)
Pad_e9062
  round 1.524 hole 0.001: 4(0,0)
Pad_e9069
  round 0.762 hole 0.001: 1(0,0)
Pad_e9072
  round 0.762 hole 0.001: 1(0,0)
Pad_e9076
  round 0.762 hole 0.001: 1(0,0)
Pad_e9079
  round 0.762 hole 0.001: 1(0,0)
Pad_e9091
  round 0.762 hole 0.001: 1(0,0)
Pad_e9097
  round 0.762 hole 0.001: 1(0,0)
Pad_e9101
  round 0.762 hole 0.001: 1(0,0)
Pad_e9106
  round 0.762 hole 0.001: 1(0,0)
Pad_e9175
  round 0.762 hole 0.001: 1(0,0)
Pad_e9184
  round 0.762 hole 0.001: 1(0,0)
Pad_e9351
  round 0.762 hole 0.001: 1(0,0)
Pad_e9355
  round 0.762 hole 0.001: 1(0,0)
Pad_e9362
  round 0.762 hole 0.001: 1(0,0)
Pad_e9885
  round 1.524 hole 0.001: 2(0,0)
QFN-56_L7.0-W7.0-P0.40-TL-EP5.2
  rect 0.7x0.2 hole 0.001: 1(-3.45,2.6) 2(-3.45,2.2) 3(-3.45,1.8) 4(-3.45,1.4) 5(-3.45,1) 6(-3.45,0.6) 7(-3.45,0.2) 8(-3.45,-0.2) 9(-3.45,-0.6) 10(-3.45,-1) 11(-3.45,-1.4) 12(-3.45,-1.8) 13(-3.45,-2.2) 14(-3.45,-2.6) 29(3.45,-2.6) 30(3.45,-2.2) 31(3.45,-1.8) 32(3.45,-1.4) 33(3.45,-1) 34(3.45,-0.6) 35(3.45,-0.2) 36(3.45,0.2) 37(3.45,0.6) 38(3.45,1) 39(3.45,1.4) 40(3.45,1.8) 41(3.45,2.2) 42(3.45,2.6)
  rect 0.2x0.7 hole 0.001: 15(-2.6,-3.45) 16(-2.2,-3.45) 17(-1.8,-3.45) 18(-1.4,-3.45) 19(-1,-3.45) 20(-0.6,-3.45) 21(-0.2,-3.45) 22(0.2,-3.45) 23(0.6,-3.45) 24(1,-3.45) 25(1.4,-3.45) 26(1.8,-3.45) 27(2.2,-3.45) 28(2.6,-3.45) 43(2.6,3.45) 44(2.2,3.45) 45(1.8,3.45) 46(1.4,3.45) 47(1,3.45) 48(0.6,3.45) 49(0.2,3.45) 50(-0.2,3.45) 51(-0.6,3.45) 52(-1,3.45) 53(-1.4,3.45) 54(-1.8,3.45) 55(-2.2,3.45) 56(-2.6,3.45)
  rect 5.2x5.2 hole 0.001: 57(0,0)
R0402
  rect 0.566x0.54 hole 0.001: 1(-0.433,0) 2(0.433,0)
R0805
  rect 1.133x1.377 hole 0.001: 1(-1,0) 2(1,0)
RJ45-TH_HR911105A
  rect 1.6x1.6 hole 1: 1(-4.45,4.355)
  round 1.6 hole 1: 2(-3.18,6.895) 3(-1.91,4.355) 4(-0.64,6.895) 5(0.63,4.355) 6(1.9,6.895) 7(3.17,4.355) 8(4.44,6.895)
  round 1.8 hole 1.1: 9(-6.625,-6.895) 10(-4.085,-6.895) 11(4.085,-6.895) 12(6.625,-6.895)
  round 2.5 hole 1.8: SH1(-7.745,1.055) SH2(7.745,1.055)
SOD-323_L1.8-W1.3-LS2.5-RD
  rect 1x0.7 hole 0.001: 1(-1.173,0) 2(1.173,0)
SOT-23-3_L2.9-W1.6-P1.90-LS2.8-BR
  rect 1.07x0.6 hole 0.001: 1(1.235,-0.95) 2(1.235,0.95) 3(-1.235,0)
SOT-23-5_L3.0-W1.7-P0.95-LS2.8-BL
  rect 0.49x1.157 hole 0.001: 1(-0.95,-1.153) 2(0,-1.153) 3(0.95,-1.153)
  rect 0.49x1.175 hole 0.001: 4(0.95,1.153) 5(-0.95,1.153)
SOT-23-6_L2.9-W1.6-P0.95-LS2.8-BR
  rect 1.1x0.6 hole 0.001: 1(1.35,-0.95) 2(1.35,0) 3(1.35,0.95) 4(-1.35,0.95) 5(-1.35,0) 6(-1.35,-0.95)
SW-SMD_4P-L4.2-W3.3-P2.15-LS5.1
  rect 1.3x0.7 hole 0.001: 1(-2.25,1.075) 2(2.25,1.075) 3(-2.25,-1.075) 4(2.25,-1.075)
TF-SMD_TF-PUSH
  rect 0.7x1.6 hole 0.001: 1(2.25,5.3) 2(1.15,5.3) 3(0.05,5.3) 4(-1.05,5.3) 5(-2.15,5.3) 6(-3.25,5.3) 7(-4.35,5.3) 8(-5.45,5.3) CD(-6.55,5.3)
  rect 1.2x1.5 hole 0.001: 10(-7.75,4.3)
  rect 1.2x2.2 hole 0.001: 11(-7.75,-5.3) 12(7.75,-5.3)
  rect 1.6x1.5 hole 0.001: 13(6.85,4.3)
USB-A-TH_4P-P1.40-V-F-C39416
  round 1.2 hole 0.8: 1(2.098,3.8) 2(0.699,3.8) 3(-0.699,3.8) 4(-2.098,3.8)
  oval 2.1x2.7 hole 1.6x2.1: 5(-3.081,1.801)
  oval 2.1x2.7 hole 1.6x2.3: 6(3.081,1.801)
  oval 3x1.8 hole 2.4x1.2: 7(-0.01,-3.8)
USB-A-TH_XUNPU_USB-303WSD-BRY
  round 1.1 hole 0.7: 1(-3.5,-1.35) 2(-1,-1.35) 3(1,-1.35) 4(3.5,-1.35) 5(4,0.15) 6(2,0.15) 7(0,0.15) 8(-2,0.15) 9(-4,0.15) 10(-3.5,1.85) 11(-1,1.85) 12(1,1.85) 13(3.5,1.85) 14(4,3.35) 15(2,3.35) 16(0,3.35) 17(-2,3.35) 18(-4,3.35)
  round 3.2 hole 2.4: 19(6.57,-3.35) 20(6.57,2.33) 21(-6.57,2.33) 22(-6.57,-3.35)
USB-C-SMD_TYPE-C-16PIN-2MD-073
  oval 1.1x2 hole 0.6x1.5: 13(-4.325,1.825) 14(4.325,1.825)
  oval 1.2x1.8 hole 0.6x1.2: 13(-4.325,-2.375) 14(4.325,-2.375)
  rect 0.55x1.1 hole 0.001: A1B12(-3.2,2.375) A4B9(-2.4,2.375) B1A12(3.2,2.375) B4A9(2.4,2.375)
  rect 0.3x1.1 hole 0.001: A5(-1.25,2.375) A6(-0.25,2.375) A7(0.25,2.375) A8(1.25,2.375) B5(1.75,2.375) B6(0.75,2.375) B7(-0.75,2.375) B8(-1.75,2.375)

## Nets
As in the schematic, except:
GND: AUDIO1.1 C1.1 C2.1 C3.1 C4.1 C5.1 C6.1 C7.1 C8.1 C9.1 C10.1 C11.1 C12.1 C13.1 C14.1 C15.1 C16.1 C17.1 C18.1 C19.1 C20.1 C21.1 C24.1 C25.2 C26.1 C27.1 C28.1 C29.1 C30.1 C31.1 C32.1 C33.1 C34.1 C35.1 C36.1 C37.1 C38.1 C39.1 C40.1 C41.1 C42.1 C43.1 C44.1 C45.1 C46.1 C47.1 C48.1 C49.1 C50.1 C51.1 C52.1 C53.1 C54.1 C55.1 C56.1 C57.1 C58.1 C59.1 C60.1 C61.1 C62.1 C63.1 C64.1 C65.1 C66.1 C67.1 C68.1 C69.1 C70.1 C71.1 C72.1 C73.1 C74.1 C75.1 C76.1 C77.1 C78.1 C79.1 C80.1 C81.1 C82.1 C83.1 C84.1 C85.1 C86.2 C87.2 C88.2 C89.2 C90.1 C91.1 C92.1 C93.1 C94.1 C95.1 C96.1 C97.1 C98.1 C99.1 C100.1 C101.1 C102.1 C103.1 C104.1 C105.1 C106.1 C107.1 C108.1 C109.1 C110.1 C111.1 C112.1 C113.1 C114.1 C115.1 C116.1 C117.1 C118.1 C119.1 C120.1 C121.1 C122.1 C123.2 C124.1 C125.2 C126.1 C127.1 C128.2 C129.1 C130.1 C131.1 C132.2 C135.1 C136.1 C137.1 C138.1 C139.2 C140.2 C141.1 C142.2 C143.2 C144.2 C147.1 C148.1 C149.2 CN1.2 CN1.5 CN1.8 CN1.11 CN1.17 CN1.20 CN1.21 CN1.22 CN1.23 D1.3 D1.8 D2.3 D2.8 D3.3 D3.8 D6.3 D6.8 DC1.2 H1.3 H2.2 J1.7 J1.8 J1.SH1 J1.SH2 LED1.1 LED2.1 NOREF#12.1 NOREF#13.3 NOREF#15.2 NOREF#16.1 NOREF#21.4 R7.2 R16.1 R17.1 R18.2 R21.1 R24.1 R30.2 R31.1 R34.1 R37.1 R38.1 R44.1 R55.1 R65.1 R67.2 R69.1 SW1.4 SW2.4 SW3.4 U1.8 U1.11 U1.37 U1.38 U1.41 U1.42 U1.48 U1.49 U1.54 U1.57 U2.A1 U2.A3 U2.A16 U2.A21 U2.A23 U2.AA4 U2.AA8 U2.AA11 U2.AA14 U2.AA16 U2.AA20 U2.AA21 U2.AB3 U2.AB13 U2.AB21 U2.AC1 U2.AC5 U2.AC11 U2.AC19 U2.AC23 U2.C12 U2.C13 U2.C14 U2.C18 U2.C22 U2.D23 U2.E1 U2.E3 U2.E5 U2.E13 U2.E15 U2.E16 U2.E18 U2.F12 U2.F13 U2.F14 U2.F15 U2.F16 U2.F17 U2.F21 U2.G7 U2.G9 U2.G15 U2.H1 U2.H7 U2.H8 U2.H9 U2.H10 U2.H12 U2.H15 U2.H16 U2.H23 U2.J7 U2.J8 U2.J9 U2.J10 U2.J11 U2.J12 U2.J15 U2.J16 U2.J17 U2.K7 U2.K8 U2.K9 U2.K10 U2.K11 U2.K12 U2.K13 U2.K14 U2.K15 U2.K16 U2.K17 U2.L7 U2.L9 U2.L10 U2.L11 U2.L12 U2.L13 U2.L14 U2.L15 U2.L18 U2.M1 U2.M7 U2.M10 U2.M11 U2.M12 U2.M13 U2.M14 U2.M15 U2.M18 U2.M23 U2.N7 U2.N10 U2.N11 U2.N12 U2.N13 U2.N14 U2.N15 U2.N18 U2.P7 U2.P10 U2.P11 U2.P12 U2.P13 U2.P14 U2.P20 U2.R8 U2.R9 U2.R10 U2.R11 U2.R12 U2.R13 U2.R14 U2.R15 U2.R17 U2.R18 U2.T7 U2.T8 U2.T9 U2.T10 U2.T11 U2.T12 U2.T13 U2.T14 U2.T15 U2.T16 U2.T18 U2.T19 U2.U6 U2.U7 U2.U9 U2.U10 U2.U11 U2.U12 U2.U15 U2.U17 U2.U18 U2.U22 U2.U23 U2.V5 U2.V7 U2.V13 U2.V17 U2.V19 U2.V20 U2.W1 U2.W3 U2.W5 U2.W7 U2.W8 U2.W10 U2.W16 U2.W17 U2.W19 U2.W21 U2.W23 U2.Y5 U2.Y7 U2.Y13 U2.Y17 U2.Y19 U3.6 U3.10 U3.11 U3.12 U3.13 U4.2 U6.2 U7.2 UD2.B2 UD2.B5 UD2.B6 UD2.B12 UD2.C3 UD2.C5 UD2.C6 UD2.D3 UD2.D12 UD2.E4 UD2.E5 UD2.E6 UD2.F4 UD2.F5 UD2.F6 UD2.F12 UD2.G3 UD2.G4 UD2.G6 UD2.G9 UD2.H2 UD2.H10 UD2.J4 UD2.J12 UD2.K2 UD2.K10 UD2.L6 UD2.L9 UD2.M4 UD2.M5 UD2.M6 UD2.M12 UD2.N4 UD2.N5 UD2.N6 UD2.P3 UD2.P12 UD2.R4 UD2.R5 UD2.R6 UD2.T2 UD2.T3 UD2.T4 UD2.T5 UD2.T6 UD2.T12 USB2.4 USB2.5 USB2.6 USB2.7 USB3.4 USB3.7 USB3.13 USB3.16 USB3.19 USB3.20 USB3.21 USB3.22 USB4.13 USB4.14 USB4.A1B12 USB4.B1A12 X1.1 X1.3
VCC18-LPDDR3: C109.2 C110.2 C122.2 NOREF#10.1 R6.2 UD2.A3 UD2.A4 UD2.A5 UD2.A6 UD2.A10 UD2.U3 UD2.U4 UD2.U5 UD2.U6 UD2.U10
VCC18-RTC: C16.2 NOREF#8.1 R4.1 R5.1 R6.1 R11.1 R56.1 U2.F20
VCC-DRAM: C8.2 C93.2 C94.2 C95.2 C96.2 C97.2 C98.2 C99.2 C100.2 C101.2 C102.2 C103.2 C104.2 C105.2 C106.2 C107.2 C115.2 C116.2 C117.2 C118.2 C119.2 C120.2 C121.2 L7.1 NOREF#11.1 R22.2 R68.2 U1.10 U2.U8 U2.U13 U2.U14 U2.U16 U2.V9 U2.V10 U2.V11 U2.V15 UD2.A8 UD2.A9 UD2.A11 UD2.C12 UD2.D4 UD2.D5 UD2.D6 UD2.E8 UD2.E12 UD2.F2 UD2.G2 UD2.G5 UD2.G12 UD2.H3 UD2.H5 UD2.H6 UD2.H8 UD2.H9 UD2.H11 UD2.H12 UD2.J5 UD2.J6 UD2.J9 UD2.J10 UD2.K5 UD2.K6 UD2.K8 UD2.K11 UD2.K12 UD2.L2 UD2.L5 UD2.L12 UD2.M2 UD2.N8 UD2.N12 UD2.P4 UD2.P5 UD2.P6 UD2.R12 UD2.U8 UD2.U9 UD2.U11
VDD-CPU: C10.2 C15.2 C60.2 C61.2 C62.2 C68.2 C69.2 C70.2 L9.1 L10.1 NOREF#26.4 U2.L16 U2.L17 U2.M16 U2.M17 U2.N16 U2.N17 U2.P15 U2.P16 U2.P17
VDD-CPUFB: NOREF#24.1 U1.39 U1.40 U2.R16 U2.T17
VDD-GPU: C21.2 C71.2 C72.2 C73.2 C74.2 C75.2 C76.2 L1.1 NOREF#7.3 U2.L8 U2.M8 U2.M9 U2.N8 U2.N9 U2.P8 U2.P9
VDD-GPUFB: NOREF#22.1 U1.47 U2.R7
VDD-SYS: C6.2 C32.2 C38.2 C45.2 C46.2 C77.2 C78.2 C79.2 C80.2 C81.2 C82.2 L8.1 NOREF#17.2 U1.9 U2.D18 U2.G12 U2.G13 U2.G14 U2.G16 U2.H13 U2.H14 U2.J13 U2.J14
AC-LDOIN: C17.2 C35.2 C40.2 C47.2 C53.2 C66.2 J1.9 J1.12 NOREF#25.1 R1.2 R9.2 R10.2 U1.31 U2.B3 U2.C3 U2.E4
ALDO1: C18.2 C41.2 C52.2 C58.2 C64.2 C67.2 NOREF#3.1 R2.1 R3.1 U1.28 U2.A22 U2.H6 U2.H18 U2.M19
ALDO3: C20.2 NOREF#27.1 U1.32
AP-RESET: C11.2 C84.2 C142.1 NOREF#14.5 R11.2 R58.1 U1.15 U2.G22
BLDO1: C2.2 C31.2 C39.2 C51.2 C108.2 NOREF#4.1 R14.2 U1.2 U2.E19 U2.P18 U2.W22
BLDO2: C1.2 C43.2 C44.2 C59.2 C90.2 NOREF.1 U1.1 U2.C19 U2.G11 U2.H11 U2.N19
BLDO3: C3.2 NOREF#9.1 U1.4
CLDO1: C13.2 C26.2 C33.2 C37.2 C123.1 C130.2 C147.2 D4.2 NOREF#6.1 Q3.1 R8.1 R25.2 R26.2 R27.2 R28.2 R29.2 R49.1 R52.1 R53.2 R57.2 U1.19 U2.E14 U2.G8 U3.4
CLDO2: C14.2 C36.2 NOREF#2.1 Q4.1 R62.1 U1.20 U2.R6
DC-VIN: C141.2 C148.2 DC1.1 NOREF#18.1 R15.2 U6.5
PMU-SCK: NOREF#23.1 R2.2 U1.23 U2.K20
PMU-SDA: NOREF#5.2 R3.2 U1.24 U2.K23
TYPE-5V: C131.2 C132.1 C149.1 NOREF#20.1 R39.1 R40.1 USB4.A4B9 USB4.B4A9
$8N87: NOREF#19.1 R60.2 SW3.1

Pads without a net: CN1 14; DC1 3; SW1 2 3; SW2 2 3; SW3 2 3; U1 5 14 21 22 55 56; U2 A8 A9 A10 AA3 AA10 B1 B2 B8 B9 B10 C1 C2 C23 D9 D11 D15 D16 E12 E17 E21 E22 F5 F8 F9 F11 G10 G20 H2 H3 H4 H5 H17 H19 H21 H22 J2 J3 J5 J6 J19 J20 J22 K1 K2 K3 K22 L2 L3 L4 L5 L6 L19 L20 L21 L22 M2 M3 M4 M5 M6 M21 M22 N2 N3 N20 N22 N23 P1 P2 P3 P4 P5 P6 P21 P22 R2 R3 R5 R19 R20 R21 R22 R23 T1 T2 T3 T20 T21 T22 U2 U3 U4 U5 U19 U21 V1 V2 V3 V21 V22 V23 W4 W11 Y21; UD2 A1 A2 A12 A13 B1 B13 C4 K9 R3 T1 T13 U1 U2 U12 U13; USB3 5 6 8 9; USB4 A6 A7 A8 B6 B7 B8

## Via types
v1: diameter 0.61, hole 0.305, Top Layer to Bottom Layer, 385 vias
v2: diameter 0.406, hole 0.305, Top Layer to Bottom Layer, 426 vias
v3: diameter 0.762, hole 0.305, Top Layer to Bottom Layer, 2 vias
v4: diameter 0.864, hole 0.305, Top Layer to Bottom Layer, 2 vias

## Routing (per net, layer and track width the routed paths; a pad name or vN(x,y) marks a point on that pad's centre or on a via; arc(x,y) is an arc through that point)
GND: length 546.9
  Top Layer w0.102: v2(58.93,47.28) 59.03,47.28 59.43,46.88 60.31,46.88 60.43,47 61.33,47 U2.C22 ; v2(52.29,23.09) 51.56,22.36 51.56,21.96 51.29,21.69 ; C51.1 64.3,36.25 v1(64.26,36.21) 62.83,36.21 62.27,36.76 U2.W23 ; 58.39,20.61 58.23,20.76 58.23,21.05 58.14,21.14 v2(58.14,21.25) ; 58.39,20.61 58.62,20.61 58.79,20.78 58.79,20.92 59.16,21.3 59.16,21.69 ; 58.39,20.61 58.21,20.44 ; U2.AB13 55.54,34.71 v2(55.5,34.71) ; U2.AA20 60.19,35.34 59.82,34.96 59.82,34.44 U2.AC19 ; U2.AA11 54.28,35.4 54.28,35.16 54.36,35.09 54.46,35.09 54.62,34.93 54.62,34.7 54.61,34.68 54.61,34.66 54.34,34.39 U2.AC11 ; UD2.H2 53.96,13.61 v2(53.85,13.5) ; v2(54.1,12.74) 54.31,12.74 UD2.K2 ; 57.64,35.51 U2.Y17 ; U2.AB21 U2.AA21 ; U2.W1 arc(47.86,36.76) 47.87,36.75 47.89,36.73 arc(48.16,36.55) 48.47,36.49 arc(48.84,36.56) U2.W3
  Top Layer w0.127: v2(62.87,44.66) 62.87,44.64 62.14,43.91 ; UD2.P12 57.86,21.53 v2(58.14,21.25) ; R21.1 53.16,24.79 C92.1 ; v2(57.28,35.14) 57.59,35.45 U2.AA16 ; v2(60.52,35.78) 60.52,36.44 U2.W21 ; UD2.J12 54.61,23.02 54.23,23.4 52.79,23.4 52.29,23.91 ; 53.96,20.09 53.96,19.83 v2(53.47,19.34) 53.42,19.29 UD2.G9
  Top Layer w0.152: 27.34,50.64 26.05,51.93 v1(24.89,51.93) ; 64.77,46.26 v2(63.88,46.26) ; U2.E5 50.44,45.65 50.04,45.25 ; 50.04,45.25 50.14,45.15 50.14,45.09 50.32,44.91 50.9,44.91 v2(50.93,44.88) ; 50.04,45.25 49.59,45.25 v2(49.03,45.81) 49.01,45.79 ; 52.66,21.69 52.34,21.37 51.68,21.37 UD2.D12 ; 53.31,14.49 UD2.G4
  Top Layer w0.203: 58.96,41.75 v2(59.09,41.88) ; 25.86,17.03 25.86,17.04 arc(25.89,17.18) C24.1 ; 58.24,36.78 58.24,37.41 ; 58.24,36.78 59.52,36.78 ; 58.24,36.78 58.23,36.76 U2.W16 ; 58.24,37.41 U2.U17 ; 58.24,37.41 57.93,37.41 v2(57.84,37.5) 57.52,37.5 57.12,37.9 57.12,37.92 57.01,38.03 ; U2.Y19 U2.W19 U2.W21 ; 52.59,15.29 v2(52.58,15.28) ; 52.59,15.29 51.96,15.29 ; 52.59,15.29 52.66,15.36 ; v2(54.99,49.19) 54.99,49.35 54.61,49.73 v2(54.61,51.73) 54.61,53.82 v2(53.66,54.77) 53.66,54.91 v2(51.93,56.63) 51.91,56.65 v2(50.17,56.65) 50.16,56.66 v2(47.62,56.66) 47.35,56.66 v2(46.22,57.8) 46.22,57.85 v2(44.95,59.12) 44.92,59.12 v2(43.76,60.28) 43.75,60.28 42.7,61.33 42.7,61.78 v1(42.8,61.89) ; 55.64,37.41 55.6,37.37 v2(55.24,37.37) 55.24,37.06 arc(55.18,36.73) v2(54.99,36.45) arc(54.93,36.14) 54.75,35.87 U2.AA11 ; U1.37 U1.38 ; v2(71.5,71.39) 71.5,69.82 v2(71.51,69.81) 71.51,68.54 v2(71.48,68.51) 71.49,68.5 v2(71.49,67.37) 71.48,67.36 v2(71.48,64.61) 71.49,64.6 71.49,62.25 v2(71.4,62.17) 71.4,62.16 70.43,61.18 v2(70.42,61.18) 70.42,61.15 v2(68.56,59.29) v2(66.38,57.12) 66.38,57.09 64.34,55.05 v2(64.34,55.03) 63.37,54.06 63.35,54.06 62.45,53.16 v2(62.45,53.16) 61.5,52.21 61.49,52.21 v2(59.74,50.45) ; C14.1 30.04,34.83 v2(31.37,34.83) ; U1.41 U1.42 ; 51.94,57.95 v2(50.33,57.95) v2(48.85,57.95) 47.88,57.95 v2(47.12,58.71) v2(46.1,59.73) 45.09,60.74 v2(45.09,60.87) v2(45.09,62.94) v2(45.09,64.12) v2(45.09,64.99) ; 52.01,16.09 UD2.E6 UD2.G6 ; 52.01,16.09 51.94,16.02 v2(51.94,15.28) ; 52.01,16.09 v2(52.26,15.84) 52.41,15.84 52.66,16.09 ; 51.74,40.86 51.62,40.86 v2(51.47,41) ; 51.74,40.86 51.78,40.82 51.78,40.63 ; 51.74,40.86 U2.N7 U2.P7 ; 51.74,41.94 v2(51.43,41.63) U2.M7 ; v2(56.32,39.32) 56.89,39.32 U2.R15 56.94,39.03 v2(56.87,38.96) 57.34,38.96 U2.T16 ; v2(56.32,39.32) 56.32,38.74 U2.T14 U2.T13 ; v2(56.32,39.32) 56.29,39.32 ; 50.44,37.41 v2(50.44,37.11) U2.W5 ; 60.19,37.41 59.93,37.67 v2(59.87,37.67) ; U2.W5 U2.W7 51.94,36.76 v2(52.08,36.89) 52.26,36.89 U2.W8 U2.W10 ; U2.W5 U2.Y5 50.99,35.56 v2(50.99,35.47) 51.06,35.47 51.45,35.86 51.48,35.86 U2.Y7 52,35.86 52,35.82 52.33,35.49 52.46,35.49 ; UD2.G4 52.66,15.29 ; U2.W1 47.12,36.76 arc(47.09,36.77) v2(47.06,36.79) ; U2.U6 U2.U7 U2.T7 ; v2(58.96,41.16) 58.96,41.31 ; 51.74,43.91 51.74,44.31 51.49,44.56 U2.G7 ; U4.2 57.66,65.7 57.03,66.34 56.95,66.34 v1(56.62,66.67) 56.62,67.21 C126.1 56.6,68.6 v1(56.62,68.62) 56.24,69 55.23,69 R24.1 ; U2.T13 U2.T12 ; U2.T13 U2.R13 ; U2.T9 U2.T10 ; U2.T9 U2.R9 ; U2.T9 U2.T8 U2.R8 ; U2.T10 U2.R10 ; U2.T10 U2.T11 U2.R11 U2.R12 U2.T12 ; U2.U22 U2.U23 ; U2.U18 58.44,38.06 v2(58.4,38.09) ; v2(60.91,50.13) 60.91,50.15 v2(63.25,52.49) v2(65.15,54.39) v2(67.44,56.68) v2(68.48,57.72) v2(69.34,58.58) v2(71.25,60.49) 72.9,62.14 v2(72.9,62.27) v2(72.9,64.55) v2(72.9,67.35) v2(72.9,68.51) 72.9,69.33 D3.3 ; v2(51.52,55.32) 51.64,55.32 v2(53.47,53.49) 53.49,53.47 v2(53.49,52.06) 53.44,52.02 53.44,49.08 v2(53.47,49.06) ; v2(55.26,45.49) 54.99,45.22 U2.F12 ; UD2.C6 v2(50.71,16.74) 50.71,16.09 50.63,16.17 v2(50.04,16.17) 50.06,16.19 UD2.B6 50.56,16.89 ; U2.L12 U2.L13 U2.L14 U2.L15 ; v2(59.87,37.67) 59.6,37.41 59.54,37.41 ; v2(59.87,37.67) 60.2,38.01 v2(60.2,38.26) 60,38.26 U2.T19 U2.T18 U2.R18 58.72,39.19 v2(58.26,39.19) ; v2(50.93,44.88) 51.1,44.71 arc(51.27,44.6) 51.46,44.56 arc(51.48,44.55) 51.49,44.54 ; 57.59,48.46 57.72,48.59 v2(57.72,49.05) 57.76,49.09 v2(57.76,49.97) v2(57.76,51.18) ; U2.D23 62.23,46.42 v2(62.23,46.14) ; U2.M10 U2.L10 U2.L11 U2.M11 U2.M12 55.5,41.31 ; U2.W17 U2.Y17 ; U2.AA21 v2(60.52,35.78) 60.51,35.78 U2.AA20 ; C92.1 52.29,23.91 v2(52.29,23.09) ; v2(62.24,49.94) 60.84,48.55 U2.A21 ; U2.U9 U2.U10 U2.U11 U2.U12 ; v2(68.71,67.15) 68.64,67.23 v2(68.64,70.72) ; R21.1 53.77,25.54 53.77,25.96 54.23,26.42 C114.1 54.31,26.57 55.3,26.57 C93.1 ; v2(67.82,39.42) 67.48,39.08 C84.1 ; 56.29,46.51 56.14,46.37 56.1,46.37 55.84,46.11 55.84,46.06 U2.E13 ; 56.29,46.51 U2.C14 U2.C13 U2.C12 ; 56.29,46.51 U2.E15 ; U2.P13 U2.P14 ; U2.T12 54.54,38.71 54.56,38.73 ; U2.A3 U2.A1 ; v2(58.86,51.03) v2(61.66,53.82) v2(63.58,55.74) v2(65.68,57.85) v2(67.75,59.91) v2(69.67,61.83) 70.1,62.27 v2(70.1,64.59) v2(70.1,67.37) v2(70.1,68.51) D2.3 D2.8 v2(70.1,71.41) ; R30.2 v1(44.58,15.15) ; v2(51.94,57.95) 52.32,57.95 55.58,54.7 v2(55.58,54.57) 55.64,54.51 55.64,52.11 v2(55.58,52.05) ; v2(46.52,61.26) 47.56,60.22 v2(47.56,60.17) 48.34,59.39 v2(48.47,59.39) 48.53,59.33 v2(50.63,59.33) 52.76,59.33 v2(52.89,59.2) v2(54.03,58.06) 55.54,56.54 v2(55.58,56.54) 57.02,55.1 57.02,52.37 v2(57.29,52.11) 57.76,51.64 57.76,51.56 ; C89.2 65.05,45.98 v1(64.86,46.18) 64.77,46.26 ; C87.2 64.94,51.47 64.14,51.47 63.86,51.2 v1(63.86,50.95) 63.86,50.69 63.62,50.45 v1(63.62,49.74) 63.62,49.57 63.63,49.57 ; U2.F15 U2.F14 56.05,45.46 56.01,45.46 55.76,45.21 U2.F13 ; C122.1 v1(44.7,16.93) ; U2.N13 U2.N14
  Top Layer w0.254: U2.K9 U2.L9 ; U2.K9 U2.K8 U2.K7 ; U2.K9 U2.K10 ; U2.K9 U2.J9 53.04,43.91 ; UD2.L6 UD2.M6 56.68,16.89 v2(56.77,16.8) 57.12,16.8 UD2.N6 ; U2.K11 U2.K10 ; U2.K11 v2(54.34,42.98) U2.J11 54.41,43.26 v2(54.74,43.6) ; U2.K11 U2.K12 ; U2.K10 U2.L10 ; U2.K10 U2.J10 53.69,43.91 53.04,43.91 ; U2.N12 54.99,40.66 v2(54.67,40.33) ; U2.N12 55.32,40.66 v2(55.33,40.67) 55.63,40.67 ; U2.N12 U2.M12 v2(54.99,41.68) U2.L12 55,41.97 v2(55,42.33) 55,42.61 U2.K12 ; v2(54.67,40.33) 54.67,40.33 U2.P12 ; v2(54.67,40.33) 54.34,40.66 U2.N11 54.33,40.67 v2(53.98,40.67) ; v2(54.67,40.33) 54.35,40.01 U2.P11 ; 56.3,41.95 v2(56.3,41.67) 56.3,41.32 U2.M14 U2.M15 ; U2.M13 55.65,41.32 v2(55.65,41.64) 55.65,41.95 U2.L13 ; U2.K7 51.15,42.61 v2(51.01,42.75) ; U2.K7 U2.L7 ; 52.39,43.01 U2.J8 52.67,43.54 ; v1(50.35,11.09) 50.63,10.81 C115.1 ; v1(43.81,51.09) 44.06,51.33 45.48,51.33 C30.1 ; v2(55.24,19.74) 55.26,19.76 55.26,20.09 ; v2(58.51,16.09) 58.55,16.05 v2(58.55,15.4) 58.66,15.29 59.16,15.29 v2(59.16,16.09) ; U2.K17 57.93,42.61 57.58,42.96 ; U2.P13 55.64,40.01 v2(55.32,40.01) ; 59.16,16.89 58.89,16.89 v2(58.8,16.8) 58.71,16.89 UD2.R6 ; 54.99,43.91 54.99,43.85 54.87,43.72 ; 22.27,32.83 22.16,32.83 v3(22.07,32.92) ; 22.27,32.83 23.47,31.63 U1.11 ; 22.27,32.83 U1.8 ; v2(50.55,14.51) 50.55,14.18 UD2.B2 ; v3(22.07,32.92) 22.07,33.85 22.07,33.85 ; v3(22.07,32.92) 21.38,33.6 U1.48 U1.49 ; v3(22.07,32.92) 20.36,31.2 U1.54 ; U2.K12 U2.K13 v2(56.29,42.61) U2.K15 U2.K16 ; v1(80.34,37.89) 79.21,39.03 C142.2 ; C104.1 C109.1 63.93,14.12 v1(64.53,14.12) ; v1(37.69,41.22) 37.31,40.84 37.29,40.84 37.25,40.8 C144.2 ; v2(51.18,14.47) 51.94,15.23 ; C89.2 65.15,45.63 65.53,45.25 v1(66.17,45.25) 67.94,45.25 68.33,44.87 v1(68.33,44.06) v1(68.33,42.45) 68.08,42.21 C88.2 ; v2(58.96,41.16) 58.91,41.1 58.91,40.65 ; U1.42 22.07,33.85 ; 22.07,33.85 22.07,35.45 U1.38 ; 65.46,51.03 65.91,50.58 v1(66.24,50.58) 67.94,50.58 v1(68.2,50.33) 68.2,49.55 ; C111.1 C91.1 45.43,38.39 v1(44.83,38.39) ; U2.E15 56.94,45.55 57.25,45.86 U2.E16 ; 57.58,42.67 57.58,42.96 ; 57.58,42.96 v2(57.5,43.04) 58.02,43.04 U2.J17 57.83,43.67 57.47,43.67 ; 57.47,43.67 57.73,43.4 ; 57.47,43.67 v2(57.45,43.67) 57.18,43.67 56.94,43.91 ; C18.1 29.97,37.44 v1(29.97,38.26) ; 56.94,43.91 U2.G15 U2.F15 ; 56.94,43.91 U2.J15 ; 68.2,49.55 v1(68.2,48.59) v1(68.2,46.52) 68.02,46.34 67.54,46.34 C86.2 ; 68.2,49.55 68.19,49.56 X1.1 ; 52.73,43.6 53.04,43.91 ; 53.04,43.91 U2.G9 ; v2(74.55,70.39) v2(74.55,67.99) v2(74.55,66.4) v2(74.55,64.88) v2(74.55,62.52) 74.55,62.14 v2(72.52,60.11) 72.52,60.1 v2(70.36,57.94) 70.36,57.9 68.34,55.88 v2(68.27,55.88) 68.27,55.87 66.2,53.81 v2(66.19,53.81) 66.11,53.81 64.13,51.83 v2(64.09,51.83) 63.2,50.93 v2(63.2,50.91) 63.2,50.9 v2(62.24,49.94) ; v2(50.29,32.68) 50.29,33.62 50.45,33.78 50.45,34.15 U2.AC5 ; 52.06,43.57 52.37,43.26 ; U2.Y5 50.21,35.88 50.14,35.88 49.9,35.64 49.9,35.57 U2.AA4 U2.AB3 ; D3.8 v2(73.03,71.54) ; 52.67,43.63 52.39,43.91 52.06,43.58 ; USB3.20 38.13,69.4 v2(39.93,67.6) 40.77,66.76 v2(40.77,66.08) 40.73,66.04 40.73,65.1 v2(40.48,64.85) 40.39,64.76 v2(40.39,63.03) 40.4,63.01 40.4,61.82 v2(40.48,61.75) 40.48,61.65 42.24,59.89 v2(42.32,59.89) 42.32,59.82 43.71,58.42 v2(43.78,58.42) 43.78,58.34 45.06,57.06 v2(45.06,57.04) 46.64,55.46 v2(46.77,55.46) 46.84,55.39 49.39,55.39 v2(49.43,55.35) 49.46,55.32 v2(51.52,55.32) ; v2(46.52,61.26) 46.47,61.31 46.47,62.98 v2(46.48,63) 46.74,63.25 46.74,65.95 48.26,67.47 49.29,67.47 USB3.21 ; v2(68.71,67.15) 68.71,64.45 v2(68.71,64.45) 68.71,62.58 v2(68.74,62.54) v2(66.84,60.64) v2(64.67,58.47) v2(62.81,56.61) v2(60.37,54.17) 57.76,51.56 57.76,51.38 ; R24.1 v1(54.86,70.39) ; 51.74,37.41 52.08,37.08 v2(52.08,36.89) ; D6.3 v2(76.2,70.45) ; 51.74,42.98 U2.J7 ; 59.16,13.69 59.16,14.64 UD2.R4 57.91,14.69 v2(57.91,14.39) ; U2.N15 U2.N14 v2(56.29,40.34) U2.P14 ; C143.2 77.72,43.41 v1(77.72,43.22) ; v2(56.9,45.5) 57.19,45.21 U2.F16 U2.F17 arc(58.47,45.26) 58.66,45.39 58.86,45.39 v2(59.1,45.62) 59.08,45.62 58.93,45.77 arc(58.92,45.82) U2.E18 ; 54.99,43.6 U2.J12 ; C124.1 59.6,61.97 v1(60.33,61.25) ; v2(56.16,27.66) 56.16,27.44 C93.1 54.68,27.6 54.23,27.6 53.99,27.84 53.99,27.87 52.99,28.87 v2(52.71,28.87) ; 52.06,43.59 51.74,43.91
  Top Layer w0.381: D3.3 v2(73.03,69.88) D3.8 ; v2(57.76,51.18) 57.76,51.38
  Top Layer w0.508: v1(22.23,40.23) C17.1 C25.2
  Top Layer w1.016: v3(22.36,63.05) J1.8 22.36,66.42 J1.7
  Bottom Layer w0.127: v2(54.73,15.29) 54.67,15.23 arc(54.58,15.17) 54.48,15.15
  Bottom Layer w0.203: v2(62.23,46.14) 62.27,46.14 C65.1 ; v2(53.05,38.99) v2(53.68,38.99) ; 53.19,44.76 53.19,44.37 53.2,44.36 ; v2(9.68,60.23) 9.97,60.23 10.16,60.42 ; C138.1 21.14,60.17 v1(21.46,60.49) ; v2(51.43,41.63) 51.36,41.69 51.16,41.69 ; v2(52.26,15.84) 52.41,15.69 arc(52.53,15.5) v2(52.58,15.28) v2(51.94,15.28) 51.83,15.16
  Bottom Layer w0.254: 57.7,42.84 C38.1 57.92,42.84 58.25,43.17 58.42,43 ; v2(60.74,45.3) 61.52,45.3 62.23,46.01 v2(62.23,46.14) ; v2(60.74,45.3) 60.74,45.24 C49.1 59.85,44.04 59.85,43.89 60.09,43.65 60.24,43.65 60.49,43.39 C50.1 60.52,43.09 C48.1 ; v2(60.74,45.3) 60.74,45.64 C39.1 ; C34.1 49.91,49.43 v2(49.27,50.07) ; C41.1 61.64,49.35 v2(62.24,49.94) ; v2(52.39,43.01) 51.77,43.01 v2(51.75,42.98) 51.51,42.75 v2(51.01,42.75) 51.01,41.84 51.16,41.69 ; v2(52.39,43.01) 53.03,43.01 v2(53.05,42.99) ; v2(52.39,43.01) 52.39,43.24 C26.1 ; 48.85,17.27 49.95,16.17 v2(50.04,16.17) 50.61,16.74 v2(50.71,16.74) ; v2(53.05,42.99) 53.66,42.99 v2(53.68,43.02) 54.38,43.02 54.57,43.21 C78.1 ; v2(53.05,42.99) 53.05,43.47 C90.1 ; 51.48,40.72 51.48,39.96 51.52,39.91 ; 51.48,40.72 51.48,41 v2(51.47,41) 51.47,40.73 51.48,40.72 ; 51.48,40.72 51.52,40.68 ; C95.1 56.98,17.02 v2(56.77,16.8) 57.15,16.42 v2(57.15,16.17) v2(57.15,15.4) v2(56.52,15.4) v2(56.52,16.17) ; v2(47.73,41.31) 48.01,41.31 50.09,39.24 ; v2(55.33,40.67) 55.57,40.67 C61.1 ; v2(56.87,38.96) 56.85,38.94 C121.1 56.39,39.24 v2(56.32,39.32) ; C97.1 C96.1 C94.1 59.6,16.8 v2(58.8,16.8) 58.8,16.45 v2(59.16,16.09) v2(58.51,16.09) 58.71,15.89 C101.1 58.71,15.57 v2(58.55,15.4) ; v2(61.98,41.18) 61.98,41.27 61.94,41.31 61.94,41.67 C48.1 ; v2(55.32,40.01) 55.65,40.34 v2(56.29,40.34) ; C68.1 59.22,41.42 59.09,41.28 ; 58.29,47.28 58.58,47.28 ; 58.58,47.28 C59.1 ; 58.58,47.28 v2(58.93,47.28) ; C32.1 54.58,42.75 v2(55,42.33) 54.58,41.92 ; 60.11,38.9 60.2,38.81 v2(60.2,38.26) ; v2(54.34,41.72) 54.39,41.72 ; C33.1 55.98,46.81 C82.1 55.26,45.81 v2(55.26,45.49) 55.33,45.42 v2(56.01,45.42) 56.14,45.29 C45.1 56.77,45.38 v2(56.9,45.5) 57.34,45.95 C77.1 ; v2(56.3,41.67) 56.3,42.6 v2(56.29,42.61) 56.29,42.64 C46.1 ; v2(55.65,41.64) 55.03,41.64 ; C81.1 58.93,45.27 arc(58.86,44.93) C58.1 ; 59.09,41.28 v2(58.96,41.16) 59.22,40.9 C70.1 ; 59.09,41.28 v2(59.09,41.88) ; C56.1 C55.1 52.49,45.88 C37.1 53.25,44.82 53.19,44.76 ; C48.1 61.41,41.97 C52.1 C44.1 60.75,40.37 v2(60.19,39.82) ; v2(53.93,39.99) 53.98,40.04 v2(53.98,40.67) ; v2(57.45,43.67) 57.49,43.63 57.49,43.05 v2(57.5,43.04) ; C54.1 50.57,44.19 C35.1 49.78,43.38 C67.1 48.26,43.34 v2(47.68,43.92) ; v2(48.02,48.45) 48.02,47.86 47.56,47.41 47.72,47.25 v2(47.72,45.87) ; C64.1 60.91,49.52 v2(60.91,50.13) ; 54.94,41.72 v2(54.99,41.68)
  vias: v1(1.43,74.42) v1(2.29,64.82) v1(3.56,19.34) v1(4.32,25.94) v1(6.03,32.42) v1(6.86,4.61) v1(7.45,55.81) v1(7.45,49.41) v1(9.27,46.45) v1(9.53,21.37) v1(9.79,41.06) v1(10.03,81.06) v1(11.62,53.38) v1(11.66,51.73) v1(12.19,2.58) v1(12.39,63.82) v1(13.46,45.19) v1(13.65,29.25) v1(15.86,7.53) v1(16,81.95) v1(16,23.59) v1(16.26,11.92) v1(16.51,75.22) v1(16.45,9.18) v1(16.89,3.08) v1(17.21,65.32) v1(17.65,23.53) v1(19.37,20.23) v1(19.43,44.87) v1(20,34.58) v1(20.07,31.91) v1(20.32,30.84) v1(21.46,30.84) v1(21.59,0.93) v1(22.86,35.15) v1(23.5,33.18) v1(23.58,10.7) v1(24,15.71) v1(24.13,35.22) v1(24.24,31.91) v1(24.26,30.84) v1(25.81,17.02) v1(25.97,15.53) v1(25.97,13.75) v1(26.02,0.93) v1(27.43,60.23) v1(28.01,20.23) v1(29.94,33.44) v1(30.04,31.79) v1(30.11,27.96) v1(32.26,12.25) v1(32.26,10.45) v1(32.39,28.23) v1(32.87,32.2) v1(33.02,3.72) v1(33.4,8.16) v1(33.66,9.82) v1(34.93,8.55) v1(35.18,37.76) v1(35.31,6.13) v1(37.21,6.51) v1(37.62,5.12) v1(39.88,6.39) v1(40.26,35.98) v1(40.26,9.56) v1(40.39,12.36) v1(41.17,5.12) v1(42.67,6.39) v1(43.69,22.9) v1(43.69,21.88) v1(43.65,19.59) v1(44.01,36.87) v1(44.16,18.58) v1(44.85,55.44) v1(44.83,54.27) v1(45.05,5.12) v1(45.59,12.74) v1(45.75,53.03) v1(46.36,6.39) v1(48.01,11.38) v1(48.08,9.56) v1(48.39,2.32) v1(48.67,5.12) v1(50.16,6.39) v1(50.68,9.69) v1(52.14,5.12) v1(53.72,6.39) v1(54.85,65.41) v1(54.86,8.67) v1(55.37,69.63) v1(56.08,5.12) v1(57.15,6.39) v1(57.7,11.34) v1(57.7,10.2) v1(59.45,5.12) v1(60.96,3.72) v1(61.34,6.39) v1(62.83,5.12) v1(64.26,9.94) v1(64.77,47.94) v1(65.28,6.39) v1(66.24,5.12) v1(66.89,49.86) v1(67.73,45.25) v1(68.2,30.39) v1(68.96,6.39) v1(69.22,16.93) v1(70.1,5.12) v1(70.23,23.79) v1(71.63,8.67) v1(72.01,6.77) v1(73.15,42.07) v1(73.53,10.7) v1(73.79,8.42) v1(74.04,33.31) v1(74.04,31.15) v1(74.04,28.87) v1(74.04,25.56) v1(74.04,22.77) v1(74.04,19.72) v1(74.04,16.93) v1(74.04,13.24) v1(74.42,53.38) v1(75.56,33.43) v1(75.56,31.15) v1(75.56,28.87) v1(75.56,25.56) v1(75.56,22.73) v1(75.56,19.72) v1(75.56,16.96) v1(75.56,13.24) v1(75.56,10.76) v1(75.69,3.85) v1(76.3,58.09) v1(76.84,55.97) v1(78.36,25.31) v1(78.49,8.16) v1(78.74,27.72) v1(80.26,66.29) v1(81.41,69.93) v1(83.78,36.36) v1(83.78,34.2) v1(83.95,42.84) v1(86.3,38.71) v1(86.32,44.43) v1(88.9,67.6) v1(89.92,20.23) v1(91.82,8.29) v1(92.58,57.69) v1(92.58,18.83) v1(93.09,2.45) v1(93.98,40.8) v1(94.23,49.82) v1(94.87,25.44) v2(45.72,46.77) v2(47.87,34.25) v2(50.05,21.77) v2(51.42,38.06) v2(51.94,12.09) v2(52.07,54.16) v2(52.46,39.24) v2(52.58,30.29) v2(53.37,38.05) v2(54.59,39.37) v2(54.69,55.64) v2(54.66,38.04) v2(55.67,38.94) v2(55.8,36.11) v2(55.75,19.34) v2(56.24,35.53) v2(56.53,21.8) v2(57.64,30.62) v2(58.28,31.85) v2(60.71,59.41) v2(61.21,58.47) v2(61.81,38.08) v2(62.15,34.02) v2(62.23,48.55) v2(62.87,59.41) v2(63.27,43.5) v2(63.25,42.81) v2(63.5,58.46) v2(65.41,42.06) v2(69.15,73.26) v2(70.65,73.26) v2(72.15,73.26) v2(73.65,73.21) v2(76.2,69.51) v2(76.65,73.21) v4(85.34,80.3) v4(86.87,79.79)
